# Altium project NB3000AL.PRJPCB (part 3 of 4)

## Sheet PULLDNx3.SCHDOC: Visual Indicators Top
size A4; DocumentNumber: 10; SheetNumber: 11; SheetTotal: 78
Used 10 times, as channels PULLDOWN, PULLDOWN, PULLDOWN, PULLDOWN, PULLDOWN, PULLDOWN, PULLDOWN, PULLDOWN, PULLDOWN, PULLDOWN. Parts and nets are listed once, with the designators drawn on the sheet.
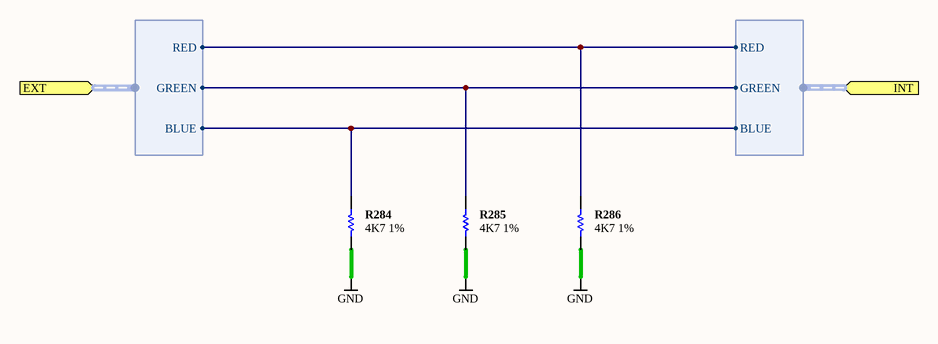
[diagram p14: PULLDNx3.SCHDOC]

### Parts
R284  4K7 1%  [RESC1005-STAR]
R285  4K7 1%  [RESC1005-STAR]
R286  4K7 1%  [RESC1005-STAR]

### Ports
EXT (harness RGB_LED), INT (harness RGB_LED)

### Harnesses
RGB_LED: GREEN, RED, BLUE

### Nets
GND: R284.1 R285.1 R286.1
NetR284_2: R284.2 ; port EXT.BLUE, port INT.BLUE
NetR285_2: R285.2 ; port EXT.GREEN, port INT.GREEN
NetR286_2: R286.2 ; port EXT.RED, port INT.RED

### Channels
PULLDOWN: designators R284=R311 R285=R312 R286=R313
PULLDOWN: designators R284=R308 R285=R309 R286=R310
PULLDOWN: designators R284=R305 R285=R306 R286=R307
PULLDOWN: designators R284=R302 R285=R303 R286=R304
PULLDOWN: designators R284=R299 R285=R300 R286=R301
PULLDOWN: designators R284=R296 R285=R297 R286=R298
PULLDOWN: designators R284=R293 R285=R294 R286=R295
PULLDOWN: designators R284=R290 R285=R291 R286=R292
PULLDOWN: designators R284=R287 R285=R288 R286=R289
PULLDOWN: no parts or ports

### Notes on the sheet
- Sheet Title
- Project Title
- Size:
- Date:
- A4
- Assy:
- Time:
- Revision:
- Sheet
- of
- File:

### Library data of the parts
R284-R286 = D-100-0088: as R1#3 on sheet FPGA; Category: Resistor; Mounting Technology: Surface Mount; Status: Production; Tolerance: 1 %

## Sheet LED_RGB_SMDx8.SCHDOC: Visual Indicators Top
size A4; DocumentNumber: 10; SheetNumber: 11; SheetTotal: 78
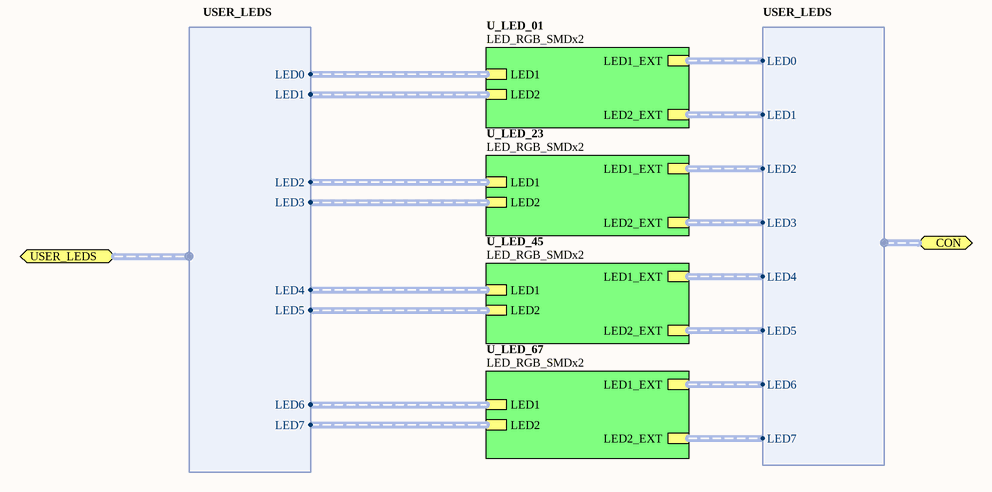
[diagram p15: LED_RGB_SMDx8.SCHDOC]

### Sub-sheets
U_LED_01 = LED_RGB_SMDx2 (file not in this document): LED1 (harness RGB_LED), LED2 (harness RGB_LED), LED1_EXT (harness RGB_LED), LED2_EXT (harness RGB_LED)
U_LED_23 = LED_RGB_SMDx2 (file not in this document): LED1 (harness RGB_LED), LED2 (harness RGB_LED), LED1_EXT (harness RGB_LED), LED2_EXT (harness RGB_LED)
U_LED_45 = LED_RGB_SMDx2 (file not in this document): LED1 (harness RGB_LED), LED2 (harness RGB_LED), LED1_EXT (harness RGB_LED), LED2_EXT (harness RGB_LED)
U_LED_67 = LED_RGB_SMDx2 (file not in this document): LED1 (harness RGB_LED), LED2 (harness RGB_LED), LED1_EXT (harness RGB_LED), LED2_EXT (harness RGB_LED)

### Ports
CON (harness USER_LEDS), USER_LEDS (harness USER_LEDS)

### Harnesses
USER_LEDS: LED0, LED1, LED2, LED3, LED4, LED5, LED6, LED7

### Notes on the sheet
- Sheet Title
- Project Title
- Size:
- Date:
- A4
- Assy:
- Time:
- Revision:
- Sheet
- of
- File:

## Sheet PWJACK+SWITCH.SchDoc: Power Jack & Switch
size A4; Organization: Altium Limited.; Address1: Level 3, 12a Rodborough Rd; Address2: Frenchs Forest 2086; Address3: NSW; Address4: AUSTRALIA; DocumentNumber: 20; Revision: 6; SheetNumber: 21; SheetTotal: 78
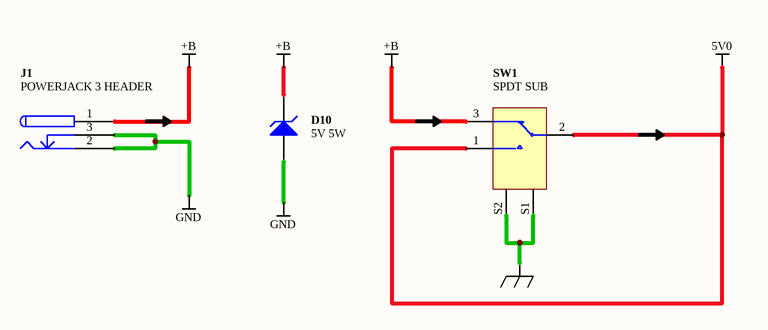
[diagram p16: PWJACK+SWITCH.SchDoc]

### Parts
(Parts that share a designator on the sheet are numbered #1, #2 ... from top to bottom, then left to right.)
D10  5V 5W  [DIOM8059]
J1#2  POWERJACK 3 HEADER  [KLD-0202]
SW1  SPDT SUB  [T8019L-TNQ]

### Nets
5V0: SW1.1 SW1.2
+B: D10.2(K) J1#2.1 SW1.3
GND: D10.1(A) J1#2.2 J1#2.3
SHIELD: SW1.S1 SW1.S2

### Notes on the sheet
- Sheet Title
- Project Title
- Size:
- Date:
- A4
- Assy:
- Time:
- Revision:
- Sheet
- of
- File:

### Library data of the parts
D10 = D-150-0001: Zener Diode, 5V 5W; Max Forward Current: mA; Rated Voltage: mV; Category: Diode-Zener; Mounting Technology: Surface Mount; Status: Production
J1#2 = D-300-0007: Connector, 3 Conductor Power Jack 2 break 2 aux contacts; ClassName: COMP_5V0; Category: Connector; Connector type: POWERJACK 3 HEADER; Status: Production
SW1 = D-301-0000: Switch, SPDT Subminiature Toggle; ClassName: COMP_5V0; Category: Switch; Status: Production

## Sheet Ethernet_RTL8201CL.SchDoc: Ethernet Interface
size A3; DocumentNumber: 21; SheetNumber: 22; SheetTotal: 78; Organization: Altium Limited.; Address1: Level 3, 12a Rodborough Rd; Address2: Frenchs Forest 2086; Address3: NSW; Address4: AUSTRALIA
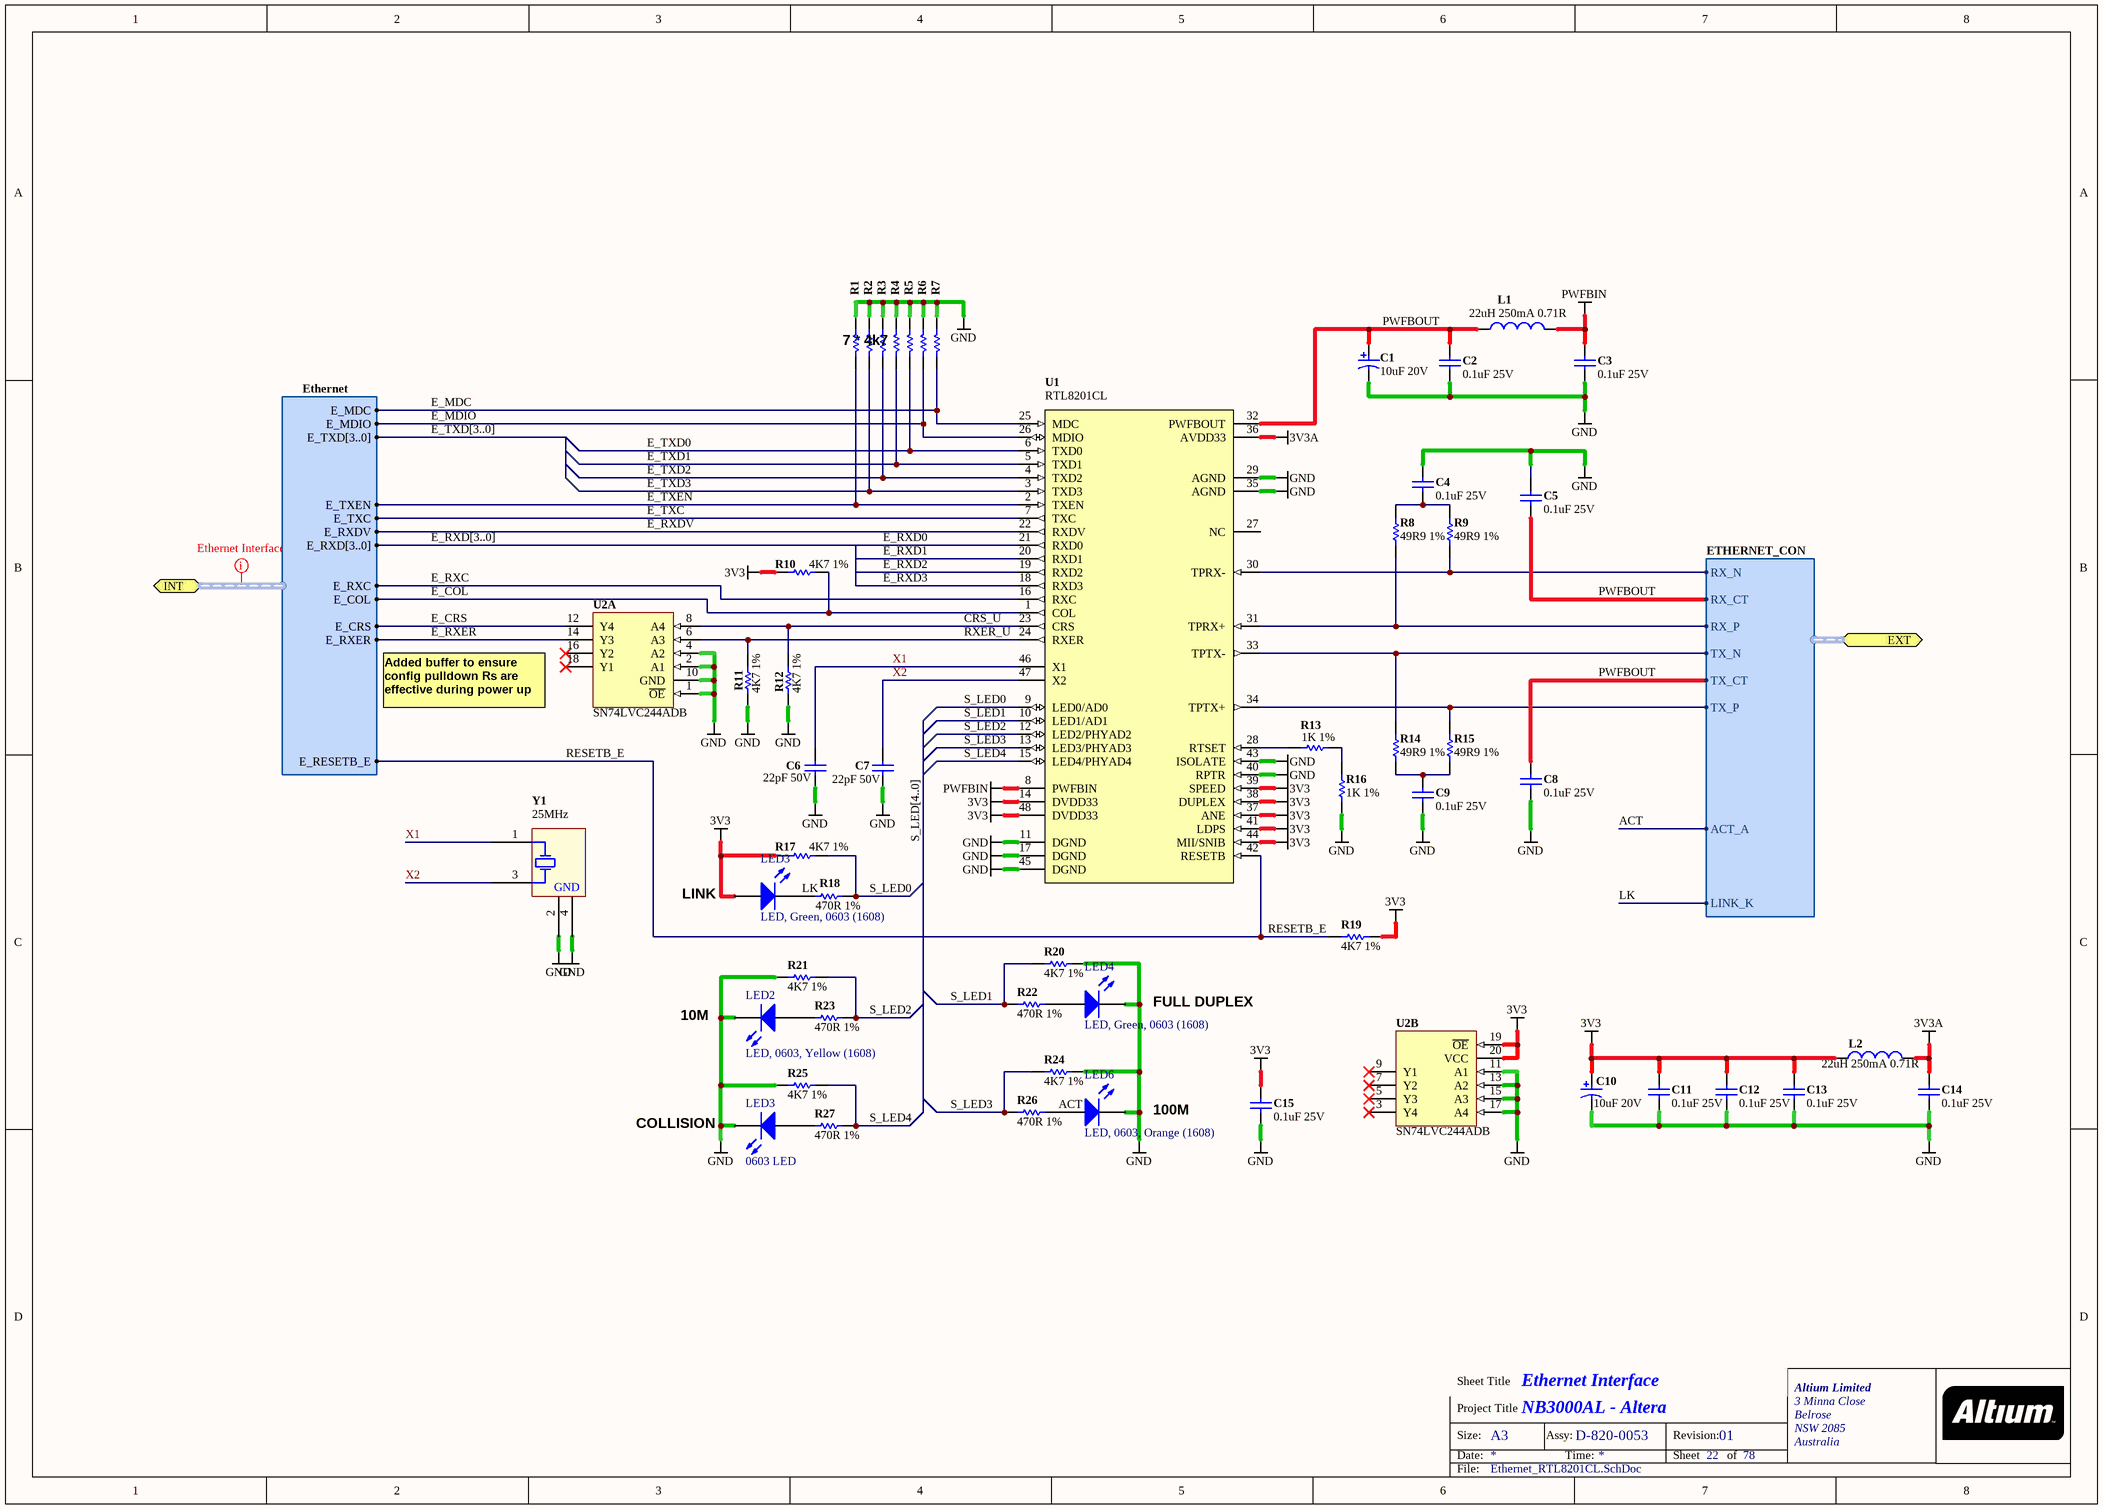
[diagram p17: Ethernet_RTL8201CL.SchDoc]

### Parts
(Parts that share a designator on the sheet are numbered #1, #2 ... from top to bottom, then left to right.)
C1#4  10uF 20V  [CAPC3528-STAR]
C2#4  0.1uF 25V  [CAPC1005-STAR]
C3#4  0.1uF 25V  [CAPC1005-STAR]
C4#4  0.1uF 25V  [CAPC1005-STAR]
C5#3  0.1uF 25V  [CAPC1005-STAR]
C6#2  22pF 50V  [CAPC1005-STAR]
C7#2  22pF 50V  [CAPC1005-STAR]
C8#2  0.1uF 25V  [CAPC1005-STAR]
C9#2  0.1uF 25V  [CAPC1005-STAR]
C10#2  10uF 20V  [CAPC3528-STAR]
C11#2  0.1uF 25V  [CAPC1005-STAR]
C12#2  0.1uF 25V  [CAPC1005-STAR]
C13#2  0.1uF 25V  [CAPC1005-STAR]
C14#2  0.1uF 25V  [CAPC1005-STAR]
C15#1  0.1uF 25V  [CAPC1005-STAR]
L1#2  22uH 250mA 0.71R  [INDC3225]
L2  22uH 250mA 0.71R  [INDC3225]
LED2  LED, 0603, Yellow (1608)  [0603LED_YELLOW]
LED3#1  LED, Green, 0603 (1608)  [0603LED_GREEN]
LED3#2  0603 LED  [0603LED_RED]
LED4  LED, Green, 0603 (1608)  [0603LED_GREEN]
LED6  LED, 0603, Orange (1608)  [0603LED_ORANGE]
R1#4  4K7 1%  [RESC1005-STAR]  (value not drawn)
R2#4  4K7 1%  [RESC1005-STAR]  (value not drawn)
R3#4  4K7 1%  [RESC1005-STAR]  (value not drawn)
R4#4  4K7 1%  [RESC1005-STAR]  (value not drawn)
R5#3  4K7 1%  [RESC1005-STAR]  (value not drawn)
R6#3  4K7 1%  [RESC1005-STAR]  (value not drawn)
R7#3  4K7 1%  [RESC1005-STAR]  (value not drawn)
R8#3  49R9 1%  [RESC2012-STAR]
R9#3  49R9 1%  [RESC2012-STAR]
R10#3  4K7 1%  [RESC1005-STAR]
R11#2  4K7 1%  [RESC1005-STAR]
R12#3  4K7 1%  [RESC1005-STAR]
R13#1  1K 1%  [RESC1005-STAR]
R14#2  49R9 1%  [RESC2012-STAR]
R15#1  49R9 1%  [RESC2012-STAR]
R16#1  1K 1%  [RESC1005-STAR]
R17  4K7 1%  [RESC1005-STAR]
R18#2  470R 1%  [RESC1005-STAR]
R19#1  4K7 1%  [RESC1005-STAR]
R20#2  4K7 1%  [RESC1005-STAR]
R21#1  4K7 1%  [RESC1005-STAR]
R22#2  470R 1%  [RESC1005-STAR]
R23#2  470R 1%  [RESC1005-STAR]
R24#2  4K7 1%  [RESC1005-STAR]
R25#1  4K7 1%  [RESC1005-STAR]
R26#1  470R 1%  [RESC1005-STAR]
R27#1  470R 1%  [RESC1005-STAR]
U1#4  RTL8201CL  [TSQFP50P900X900-48]
U2#1  SN74LVC244ADB  [SOP65P780-20]  (parts A,B of 2)
Y1#1  25MHz  [XTAL-200X126-4]

### Ports
EXT (harness ETHERNET_CON), INT (harness Ethernet)

### Harnesses
Ethernet: E_MDC, E_MDIO, E_TXD[3..0], E_TXC, E_TXEN, E_RXDV, E_RXD[3..0], E_RESETB_E, E_RXC, E_COL, E_CRS, E_RXER
ETHERNET_CON: TX_P, TX_N, RX_P, RX_N, RX_CT, TX_CT, LINK_K, ACT_A

### Nets
3V3: C10#2.1 C11#2.2 C12#2.2 C13#2.2 C15#1.2 L2.1 LED3#1.1(A) R10#3.2 R17.2 R19#1.2 U1#4.14(DVDD33) U1#4.37(ANE) U1#4.38(DUPLEX) U1#4.39(SPEED) U1#4.41(LDPS) U1#4.44(MII/SNIB) U1#4.48(DVDD33) U2#1.19(~{OE}) U2#1.20(VCC)
3V3A: C14#2.2 L2.2 U1#4.36(AVDD33)
GND: C1#4.2 C2#4.1 C3#4.1 C4#4.2 C5#3.2 C6#2.1 C7#2.1 C8#2.1 C9#2.1 C10#2.2 C11#2.1 C12#2.1 C13#2.1 C14#2.1 C15#1.1 LED2.2(K) LED3#2.2(K) LED4.2(K) LED6.2(K) R1#4.2 R2#4.2 R3#4.2 R4#4.2 R5#3.2 R6#3.2 R7#3.2 R11#2.2 R12#3.2 R16#1.1 R20#2.1 R21#1.2 R24#2.1 R25#1.2 U1#4.11(DGND) U1#4.17(DGND) U1#4.29(AGND) U1#4.35(AGND) U1#4.40(RPTR) U1#4.43(ISOLATE) U1#4.45(DGND) U2#1.1(~{OE}) U2#1.2(A1) U2#1.4(A2) U2#1.10(GND) U2#1.11(A1) U2#1.13(A2) U2#1.15(A3) U2#1.17(A4) Y1#1.2(GND) Y1#1.4(GND)
PWFBIN: C3#4.2 L1#2.2 U1#4.8(PWFBIN)
ACT: LED6.1(A) R26#1.2 ; port EXT.ACT_A
CRS_U: R12#3.1 U1#4.23(CRS) U2#1.8(A4)
E_COL: R10#3.1 U1#4.1(COL) ; port INT.E_COL
E_CRS: U2#1.12(Y4) ; port INT.E_CRS
E_MDC: R7#3.1 U1#4.25(MDC) ; port INT.E_MDC
E_MDIO: R6#3.1 U1#4.26(MDIO) ; port INT.E_MDIO
E_RXC: U1#4.16(RXC) ; port INT.E_RXC
E_RXD0: U1#4.21(RXD0)
E_RXD1: U1#4.20(RXD1)
E_RXD2: U1#4.19(RXD2)
E_RXD3: U1#4.18(RXD3)
E_RXDV: U1#4.22(RXDV) ; port INT.E_RXDV
E_RXER: U2#1.14(Y3) ; port INT.E_RXER
E_TXC: U1#4.7(TXC) ; port INT.E_TXC
E_TXD0: R5#3.1 U1#4.6(TXD0)
E_TXD1: R4#4.1 U1#4.5(TXD1)
E_TXD2: R3#4.1 U1#4.4(TXD2)
E_TXD3: R2#4.1 U1#4.3(TXD3)
E_TXEN: R1#4.1 U1#4.2(TXEN) ; port INT.E_TXEN
LK: LED3#1.2(K) R18#2.2 ; port EXT.LINK_K
PWFBOUT: C1#4.1 C2#4.2 C5#3.1 C8#2.2 L1#2.1 U1#4.32(PWFBOUT) ; port EXT.RX_CT, port EXT.TX_CT
RESETB_E: R19#1.1 U1#4.42(RESETB) ; port INT.E_RESETB_E
RXER_U: R11#2.1 U1#4.24(RXER) U2#1.6(A3)
S_LED0: R17.1 R18#2.1 U1#4.9(LED0/AD0)
S_LED1: R20#2.2 R22#2.1 U1#4.10(LED1/AD1)
S_LED2: R21#1.1 R23#2.1 U1#4.12(LED2/PHYAD2)
S_LED3: R24#2.2 R26#1.1 U1#4.13(LED3/PHYAD3)
S_LED4: R25#1.1 R27#1.1 U1#4.15(LED4/PHYAD4)
X1: C6#2.2 U1#4.46(X1) Y1#1.1(X1)
X2: C7#2.2 U1#4.47(X2) Y1#1.3(X2)
NetC4#4_1: C4#4.1 R8#3.2 R9#3.2
NetC9#2_2: C9#2.2 R14#2.1 R15#1.1
NetLED2_1: LED2.1(A) R23#2.2
NetLED3#2_1: LED3#2.1(A) R27#1.2
NetLED4_1: LED4.1(A) R22#2.2
NetR8#3_1: R8#3.1 U1#4.31(TPRX+) ; port EXT.RX_P
NetR9#3_1: R9#3.1 U1#4.30(TPRX-) ; port EXT.RX_N
NetR13#1_1: R13#1.1 R16#1.2
NetR13#1_2: R13#1.2 U1#4.28(RTSET)
NetR14#2_2: R14#2.2 U1#4.33(TPTX-) ; port EXT.TX_N
NetR15#1_2: R15#1.2 U1#4.34(TPTX+) ; port EXT.TX_P

Not connected (* = marked no-connect by the designer): U1#4 27(NC); U2#1 3(Y4)* 5(Y3)* 7(Y2)* 9(Y1)* 16(Y2)* 18(Y1)*

### Buses and harness runs
bus E_RXD[3..0]
bus E_TXD[3..0]
bus S_LED[4..0]

### Layout directives
net class Ethernet Interface: (no net found under the mark)

### Notes on the sheet
- (near R1#4) 7 * 4k7
- (near U2#1) Added buffer to ensure config pulldown Rs are effective during power up
- (near U2#1) LINK
- (near U2#1) 10M
- (near U2#1) FULL DUPLEX
- (near U2#1) COLLISION
- (near U2#1) 100M
- Sheet Title
- Project Title
- Size:
- Date:
- A3
- Assy:
- Time:
- Revision:
- Sheet
- of
- File:

### Library data of the parts
C1#4 C10#2 = D-101-0007: Capacitor, Tantalum, 10uF 10% 20V MCCT-B (3528); Polarity: Polarized; Capacitance: 10 uF; Category: Capacitor; Mounting Technology: Surface Mount; Rated Voltage: 20 V; Status: Production; Technology: Tantalum; Tolerance: 10 %
C2#4 C3#4 C4#4 C5#3 C8#2 C9#2 C11#2 C12#2 C13#2 C14#2 C15#1 = D-101-0045: Capacitor, Ceramic, 0.1uF 25V 0402 (1005); Dielectric: X7R; Polarity: Non-Polarized; Tolerance: 10 %; Capacitance: 0.1 uF; Category: Capacitor; Mounting Technology: Surface Mount; Rated Voltage: 25 V; Status: Deprecated; Technology: Ceramic
C6#2 C7#2 = D-101-0059: Capacitor, Ceramic, 22pF 5% 50V 0402 (1005) COG; Polarity: Non-Polarized; Capacitance: 22 pF; Category: Capacitor; Dielectric: COG; Mounting Technology: Surface Mount; Rated Voltage: 50 V; Status: Unreleased; Technology: Ceramic; Tolerance: 5 %
L1#2 L2 = D-102-0006: Inductor, Coil 22uH  1210 (3225) LQH32CN220K21L; Max Input Current: mA; Category: Inductor; Inductance: 22 uH; Mounting Technology: Surface Mount; Status: Production
LED2 = D-153-0007: Brightness: 120mcd; Color: Yellow/Amber; Peak Wave Length: nm; Category: LED; Mounting Technology: Surface Mount; Status: Production
LED3#1 LED4 = D-153-0002: Brightness: 50mcd; Peak Wave Length: nm; Category: LED; Color: Green; Mounting Technology: Surface Mount; Status: Production
LED3#2 = D-153-0009: LED, Red 0603 (1608) 63mCd; Peak Wave Length: 630nm; Category: LED; Brightness: 63mcd; Color: Red; Mounting Technology: Surface Mount; Status: Unreleased
LED6 = D-153-0006: Brightness: 200mcd; Peak Wave Length: nm; Category: LED; Color: Orange; Mounting Technology: Surface Mount; Status: Production
R1#4 R2#4 R3#4 R4#4 R5#3 R6#3 R7#3 R10#3 R11#2 R12#3 R17 R19#1 R20#2 R21#1 R24#2 R25#1 = D-100-0088: Resistor, 4K7 1% 0402 (1005); Power Rating: 63 mW; Resistance: 4.7 K; Category: Resistor; Mounting Technology: Surface Mount; Status: Production; Tolerance: 1 %
R8#3 R9#3 R14#2 R15#1 = D-100-0017: Resistor, 49R9 1% 0805 (2012); Power Rating: mW; Resistance: 49.9 R; Category: Resistor; Mounting Technology: Surface Mount; Status: Production; Tolerance: 1 %
R13#1 R16#1 = D-100-0121: Resistor, 1K 1% 0402 (1005); Power Rating: 63 mW; Category: Resistor; Mounting Technology: Surface Mount; Resistance: 1 K; Status: Production; Tolerance: 1 %
R18#2 R22#2 R23#2 R26#1 R27#1 = D-100-0093: Resistor, 470R 1% 0402 (1005); Power Rating: 63 mW; Category: Resistor; Mounting Technology: Surface Mount; Resistance: 470 R; Status: Production; Tolerance: 1 %
U1#4 = D-221-0000: RTL8201CL-VD, Single-Chip/Single-Port 10/100 Fast Ethernet Phyceiver; Comm Standard: None; Category: IC-Communication; Mounting Technology: Surface Mount; Status: Production
U2#1 = D-205-0000: SN74LVC244ADBR,  Octal Buffer/Driver with 3-State Outputs, 2.0V - 3.6V; Category: IC-Logic; Status: Production
Y1#1 = D-103-0030: Crystal, SMD, 25.000000MHz Stab=50ppm 18.0pF; Frequency Stability: 50ppm; Load Capacitance: 18pF; Nominal Operational Voltage: mV; Frequency Tolerance: 50ppm; Mounting Technology: Surface Mount; Nominal Fequency: 25MHz; Status: Unreleased; Category: Crystal

## Sheet HOST_JTAG.SchDoc: Local MCU Debug Connector
size A4; DocumentNumber: 24; SheetNumber: 25; SheetTotal: 78
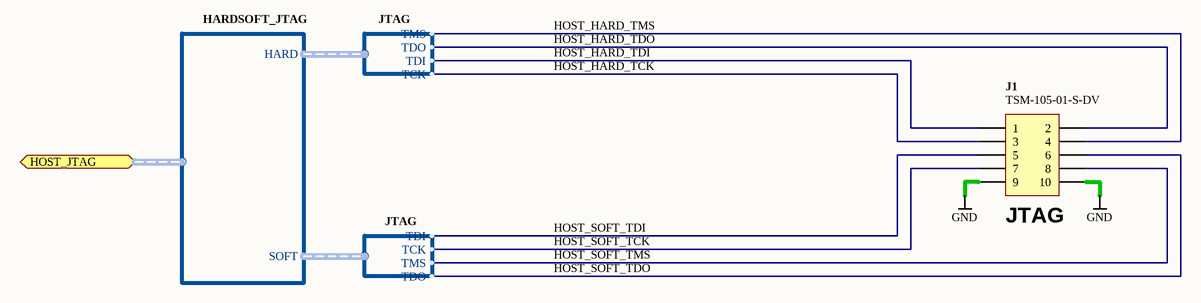
[diagram p18: HOST_JTAG.SchDoc]

### Parts
(Parts that share a designator on the sheet are numbered #1, #2 ... from top to bottom, then left to right.)
J1#3  TSM-105-01-S-DV  [TSM-105-01-DV]

### Ports
HOST_JTAG (harness HARDSOFT_JTAG)

### Harnesses
JTAG: TMS, TDO, TDI, TCK
HARDSOFT_JTAG: HARD, SOFT

### Nets
GND: J1#3.9 J1#3.10
HOST_HARD_TCK: J1#3.3 ; harness JTAG.TCK
HOST_HARD_TDI: J1#3.1 ; harness JTAG.TDI
HOST_HARD_TDO: J1#3.2 ; harness JTAG.TDO
HOST_HARD_TMS: J1#3.4 ; harness JTAG.TMS
HOST_SOFT_TCK: J1#3.7 ; harness JTAG.TCK
HOST_SOFT_TDI: J1#3.5 ; harness JTAG.TDI
HOST_SOFT_TDO: J1#3.6 ; harness JTAG.TDO
HOST_SOFT_TMS: J1#3.8 ; harness JTAG.TMS

### Notes on the sheet
- (near J1#3) JTAG
- Sheet Title
- Project Title
- Size:
- Date:
- A4
- Assy:
- Time:
- Revision:
- Sheet
- of
- File:

### Library data of the parts
J1#3 = D-300-0076: Non-Boxed Header IDC, 2 X 5 Pin SMD; Connector type: Boxed; Max Current: mA; Category: Connector; Mounting Technology: Surface Mount; Status: Unreleased

## Sheet USERPWR.SchDoc: USER IO Power Loopback
size A4; Organization: Altium Limited.
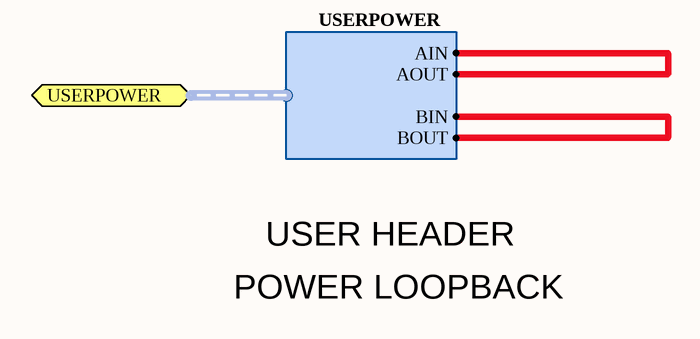
[diagram p19: USERPWR.SchDoc]

### Ports
USERPOWER (harness USERPOWER)

### Harnesses
USERPOWER: AIN, BIN, AOUT, BOUT

### Nets
(unnamed): port USERPOWER.AIN, port USERPOWER.AOUT
(unnamed): port USERPOWER.BIN, port USERPOWER.BOUT

### Notes on the sheet
- POWER LOOPBACK
- USER HEADER
- Sheet Title
- Project Title
- Size:
- Date:
- A4
- Assy:
- Time:
- Revision:
- Sheet
- of
- File:

## Sheet Host_FPGA.SchDoc: Host Controller - Altera - EP3C10
size A2; Organization: Altium Limited.; Revision: 6; PageSetup: Record=PageOptions|CenterHorizontal=True|CenterVertical=True|PrintScale=0.47|XCorrection=1.00|YCorrection=1.00|PrintKind=0|BorderSize=5000000|LeftOffset=0|BottomOffset=0|Orientation=2|PaperLength=1000|PaperWidth=1000|Scale=100|PaperSource=7|PrintQuality=1200|MediaType=1|DitherType=10|PaperKind=A4 (210 x 297 mm)|PrintScaleMode=1
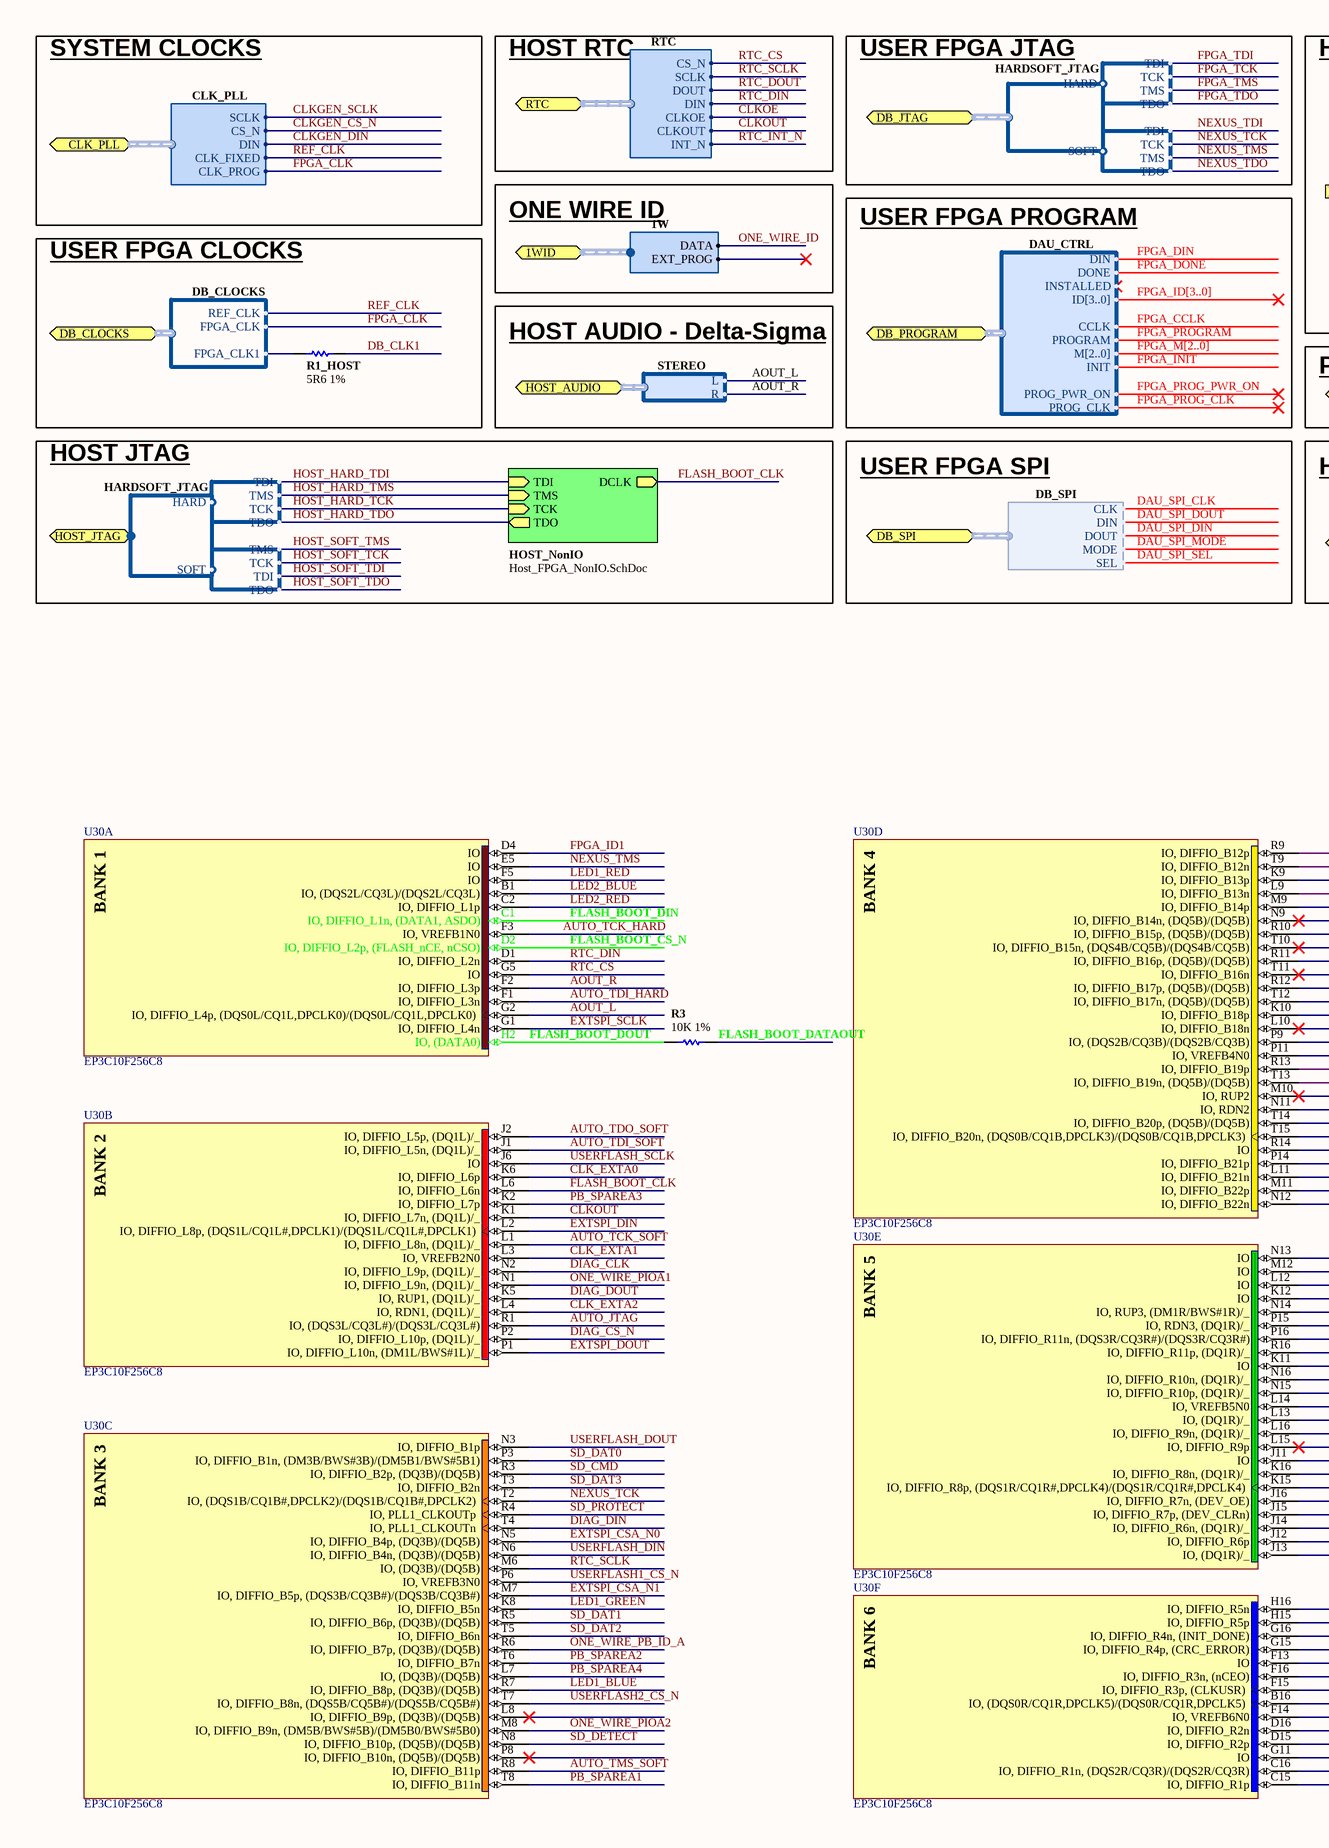
[diagram p20: Host_FPGA.SchDoc, left]
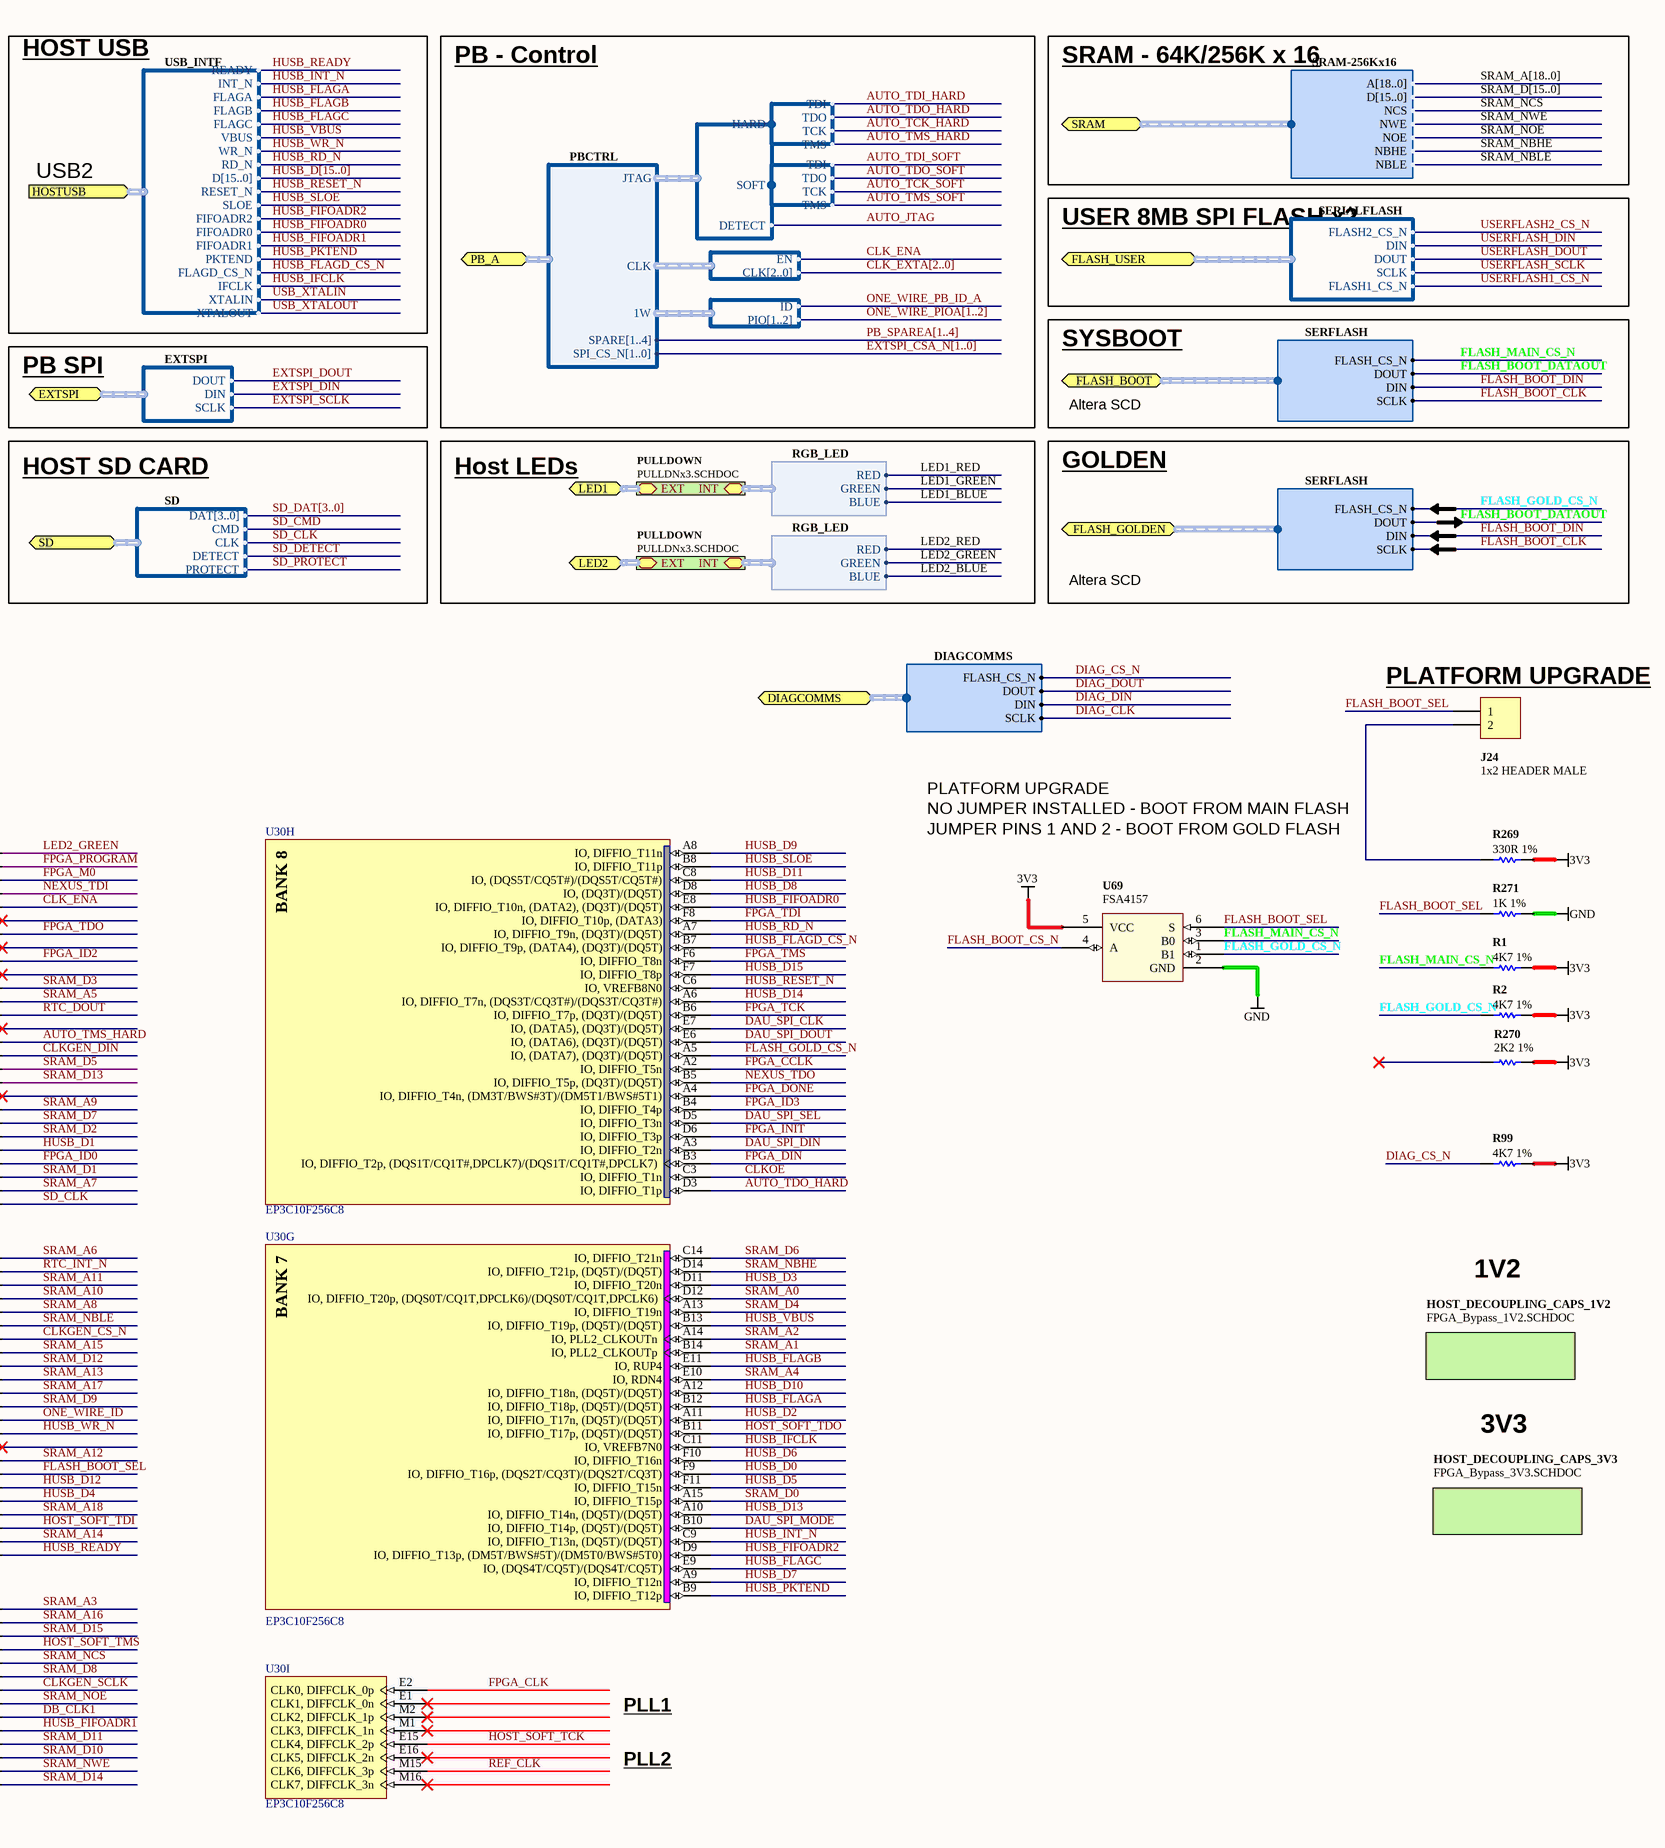
[diagram p21: Host_FPGA.SchDoc, right]

### Parts
(Parts that share a designator on the sheet are numbered #1, #2 ... from top to bottom, then left to right.)
J24  1x2 HEADER MALE  [HDR1X2]
R1#5  4K7 1%  [RESC1005-STAR]
R1_HOST  5R6 1%  [RESC1005-STAR]
R2#5  4K7 1%  [RESC1005-STAR]
R3#5  10K 1%  [RESC1005-STAR]
R99  4K7 1%  [RESC1005-STAR]
R269  330R 1%  [RESC1005-STAR]
R270  2K2 1%  [RESC1005-STAR]
R271  1K 1%  [RESC1005-STAR]
U30  EP3C10F256C8  [FBGA256-2]  (parts A,B,C,D,E,F,G,H,I of 13)
U69  FSA4157  [SC70_6L]

### Blocks framed on the sheet
USER FPGA CLOCKS: R1_HOST

### Sub-sheets
HOST_DECOUPLING_CAPS_1V2 = FPGA_Bypass_1V2.SCHDOC: no entries
HOST_DECOUPLING_CAPS_3V3 = FPGA_Bypass_3V3.SCHDOC: no entries
HOST_NonIO = Host_FPGA_NonIO.SchDoc: TMS (in), TCK (in), TDI (in), TDO (out), DCLK (out)
PULLDOWN = PULLDNx3.SCHDOC: EXT, INT (harness RGB_LED)
PULLDOWN = PULLDNx3.SCHDOC: EXT, INT (harness RGB_LED)

### Ports
1WID (harness 1W), CLK_PLL (harness CLK_PLL), DB_CLOCKS (harness DB_CLOCKS), DB_JTAG (harness HARDSOFT_JTAG), DB_PROGRAM (harness DAU_CTRL), DB_SPI (harness DB_SPI), DIAGCOMMS (harness DIAGCOMMS), EXTSPI (harness EXTSPI), FLASH_BOOT (harness SERFLASH), FLASH_GOLDEN (harness SERFLASH), FLASH_USER (harness SERIALFLASH), HOST_AUDIO (harness STEREO), HOST_JTAG (harness HARDSOFT_JTAG), HOSTUSB (harness USB_INTF), LED1 (harness RGB_LED), LED2 (harness RGB_LED), PB_A (harness PBCTRL), RTC (harness RTC), SD (harness SD), SRAM (harness SRAM-256Kx16)

### Harnesses
SERIALFLASH: FLASH2_CS_N, DIN, DOUT, SCLK, FLASH1_CS_N
JTAG: TMS, TDO, TDI, TCK
HARDSOFT_JTAG: HARD, SOFT
SD: DAT[3..0], CMD, CLK, DETECT, PROTECT
STEREO: L, R
RTC: CS_N, DIN, DOUT, INT_N, SCLK, CLKOUT, CLKOE
DAU_CTRL: DIN, DONE, INSTALLED, ID[3..0], CCLK, PROGRAM, M[2..0], INIT, PROG_PWR_ON, PROG_CLK
1W: DATA, EXT_PROG
CLK_PLL: CLK_FIXED, CLK_PROG, CS_N, DIN, SCLK
SRAM-256Kx16: A[18..0], D[15..0], NCS, NWE, NOE, NBHE, NBLE
RGB_LED: GREEN, RED, BLUE
DB_CLOCKS: REF_CLK, FPGA_CLK, FPGA_CLK1
DB_SPI: MODE, SEL, CLK, DIN, DOUT
JTAG_CONFIG: HARD, SOFT, DETECT
JTAG: TDI, TDO, TCK, TMS
GATE_CLOCKS: EN, CLK[2..0]
ONE_WIRE: ID, PIO[1..2]
PBCTRL: JTAG, CLK, 1W, SPI_CS_N[1..0], SPARE[1..4]
EXTSPI: DOUT, DIN, SCLK
SERFLASH: DIN, DOUT, SCLK, FLASH_CS_N
USB_INTF: READY, INT_N, SLOE, FIFOADR2, FIFOADR0, FIFOADR1, PKTEND, FLAGD_CS_N, FLAGA, FLAGB, FLAGC, WR_N, RD_N, D[15..0], RESET_N, IFCLK, XTALIN, VBUS, XTALOUT
DIAGCOMMS: DIN, DOUT, SCLK, FLASH_CS_N

### Nets
3V3: R1#5.2 R2#5.2 R99.2 R269.2 R270.2 U69.5(VCC)
GND: R271.2 U69.2(GND)
AOUT_L: U30.G2(IO,_DIFFIO_L4p,_(DQS0L/CQ1L,DPCLK0)/(DQS0L/CQ1L,DPCLK0)) ; port HOST_AUDIO.L
AOUT_R: U30.F2(IO,_DIFFIO_L3p) ; port HOST_AUDIO.R
AUTO_JTAG: U30.R1(IO,_(DQS3L/CQ3L#)/(DQS3L/CQ3L#)) ; harness JTAG_CONFIG.DETECT
AUTO_TCK_HARD: U30.F3(IO,_VREFB1N0) ; harness JTAG.TCK
AUTO_TCK_SOFT: U30.L1(IO,_DIFFIO_L8n,_(DQ1L)/_) ; harness JTAG.TCK
AUTO_TDI_HARD: U30.F1(IO,_DIFFIO_L3n) ; harness JTAG.TDI
AUTO_TDI_SOFT: U30.J1(IO,_DIFFIO_L5n,_(DQ1L)/_) ; harness JTAG.TDI
AUTO_TDO_HARD: U30.D3(IO,_DIFFIO_T1p) ; harness JTAG.TDO
AUTO_TDO_SOFT: U30.J2(IO,_DIFFIO_L5p,_(DQ1L)/_) ; harness JTAG.TDO
AUTO_TMS_HARD: U30.P9(IO,_(DQS2B/CQ3B)/(DQS2B/CQ3B)) ; harness JTAG.TMS
AUTO_TMS_SOFT: U30.R8(IO,_DIFFIO_B11p) ; harness JTAG.TMS
CLK_ENA: U30.M9(IO,_DIFFIO_B14p) ; harness GATE_CLOCKS.EN
CLK_EXTA0: U30.K6(IO,_DIFFIO_L6p)
CLK_EXTA1: U30.L3(IO,_VREFB2N0)
CLK_EXTA2: U30.L4(IO,_RDN1,_(DQ1L)/_)
CLKGEN_CS_N: U30.P16(IO,_DIFFIO_R11n,_(DQS3R/CQ3R#)/(DQS3R/CQ3R#)) ; port CLK_PLL.CS_N
CLKGEN_DIN: U30.P11(IO,_VREFB4N0) ; port CLK_PLL.DIN
CLKGEN_SCLK: U30.F15(IO,_DIFFIO_R3p,_(CLKUSR)) ; port CLK_PLL.SCLK
CLKOE: U30.C3(IO,_DIFFIO_T1n) ; port RTC.CLKOE
CLKOUT: U30.K1(IO,_DIFFIO_L7n,_(DQ1L)/_) ; port RTC.CLKOUT
DAU_SPI_CLK: U30.E7(IO,_(DATA5),_(DQ3T)/(DQ5T)) ; port DB_SPI.CLK
DAU_SPI_DIN: U30.A3(IO,_DIFFIO_T2n) ; port DB_SPI.DOUT
DAU_SPI_DOUT: U30.E6(IO,_(DATA6),_(DQ3T)/(DQ5T)) ; port DB_SPI.DIN
DAU_SPI_MODE: U30.B10(IO,_DIFFIO_T14p,_(DQ5T)/(DQ5T)) ; port DB_SPI.MODE
DAU_SPI_SEL: U30.D5(IO,_DIFFIO_T3n) ; port DB_SPI.SEL
DB_CLK1: R1_HOST.1 U30.F14(IO,_VREFB6N0)
DIAG_CLK: U30.N2(IO,_DIFFIO_L9p,_(DQ1L)/_) ; port DIAGCOMMS.SCLK
DIAG_CS_N: R99.1 U30.P2(IO,_DIFFIO_L10p,_(DQ1L)/_) ; port DIAGCOMMS.FLASH_CS_N
DIAG_DIN: U30.T4(IO,_PLL1_CLKOUTn) ; port DIAGCOMMS.DIN
DIAG_DOUT: U30.K5(IO,_RUP1,_(DQ1L)/_) ; port DIAGCOMMS.DOUT
EXTSPI_CSA_N0: U30.N5(IO,_DIFFIO_B4p,_(DQ3B)/(DQ5B))
EXTSPI_CSA_N1: U30.M7(IO,_DIFFIO_B5p,_(DQS3B/CQ3B#)/(DQS3B/CQ3B#))
EXTSPI_DIN: U30.L2(IO,_DIFFIO_L8p,_(DQS1L/CQ1L#,DPCLK1)/(DQS1L/CQ1L#,DPCLK1)) ; port EXTSPI.DIN
EXTSPI_DOUT: U30.P1(IO,_DIFFIO_L10n,_(DM1L/BWS#1L)/_) ; port EXTSPI.DOUT
EXTSPI_SCLK: U30.G1(IO,_DIFFIO_L4n) ; port EXTSPI.SCLK
FLASH_BOOT_CLK: U30.L6(IO,_DIFFIO_L6n) ; sheet HOST_NonIO/DCLK, port FLASH_BOOT.SCLK, port FLASH_GOLDEN.SCLK
FLASH_BOOT_CS_N: U30.D2(IO,_DIFFIO_L2p,_(FLASH_nCE,_nCSO)) U69.4(A)
FLASH_BOOT_DATAOUT: R3#5.2 ; port FLASH_BOOT.DOUT, port FLASH_GOLDEN.DOUT
FLASH_BOOT_DIN: U30.C1(IO,_DIFFIO_L1n,_(DATA1,_ASDO)) ; port FLASH_BOOT.DIN, port FLASH_GOLDEN.DIN
FLASH_BOOT_DOUT: R3#5.1 U30.H2(IO,_(DATA0))
FLASH_BOOT_SEL: J24.1 R271.1 U30.K16(IO,_DIFFIO_R8n,_(DQ1R)/_) U69.6(S)
FLASH_GOLD_CS_N: R2#5.1 U30.A5(IO,_(DATA7),_(DQ3T)/(DQ5T)) U69.1(B1) ; port FLASH_GOLDEN.FLASH_CS_N
FLASH_MAIN_CS_N: R1#5.1 U69.3(B0) ; port FLASH_BOOT.FLASH_CS_N
FPGA_CCLK: U30.A2(IO,_DIFFIO_T5n) ; port DB_PROGRAM.CCLK
FPGA_CLK: U30.E2(CLK0,_DIFFCLK_0p) ; port CLK_PLL.CLK_PROG, port DB_CLOCKS.FPGA_CLK
FPGA_DIN: U30.B3(IO,_DIFFIO_T2p,_(DQS1T/CQ1T#,DPCLK7)/(DQS1T/CQ1T#,DPCLK7)) ; port DB_PROGRAM.DIN
FPGA_DONE: U30.A4(IO,_DIFFIO_T4n,_(DM3T/BWS#3T)/(DM5T1/BWS#5T1)) ; port DB_PROGRAM.DONE
FPGA_ID0: U30.P14(IO,_DIFFIO_B21p)
FPGA_ID1: U30.D4(IO)
FPGA_ID2: U30.R11(IO,_DIFFIO_B16p,_(DQ5B)/(DQ5B))
FPGA_ID3: U30.B4(IO,_DIFFIO_T4p)
FPGA_INIT: U30.D6(IO,_DIFFIO_T3p) ; port DB_PROGRAM.INIT
FPGA_M0: U30.K9(IO,_DIFFIO_B13p)
FPGA_PROG_CLK: port DB_PROGRAM.PROG_CLK
FPGA_PROG_PWR_ON: port DB_PROGRAM.PROG_PWR_ON
FPGA_PROGRAM: U30.T9(IO,_DIFFIO_B12n) ; port DB_PROGRAM.PROGRAM
FPGA_TCK: U30.B6(IO,_DIFFIO_T7p,_(DQ3T)/(DQ5T)) ; harness JTAG.TCK
FPGA_TDI: U30.F8(IO,_DIFFIO_T10p,_(DATA3)) ; harness JTAG.TDI
FPGA_TDO: U30.R10(IO,_DIFFIO_B15p,_(DQ5B)/(DQ5B)) ; harness JTAG.TDO
FPGA_TMS: U30.F6(IO,_DIFFIO_T8n) ; harness JTAG.TMS
HOST_HARD_TCK: sheet HOST_NonIO/TCK, harness JTAG.TCK
HOST_HARD_TDI: sheet HOST_NonIO/TDI, harness JTAG.TDI
HOST_HARD_TDO: sheet HOST_NonIO/TDO, harness JTAG.TDO
HOST_HARD_TMS: sheet HOST_NonIO/TMS, harness JTAG.TMS
HOST_SOFT_TCK: U30.E15(CLK4,_DIFFCLK_2p) ; harness JTAG.TCK
HOST_SOFT_TDI: U30.J14(IO,_DIFFIO_R6n,_(DQ1R)/_) ; harness JTAG.TDI
HOST_SOFT_TDO: U30.B11(IO,_DIFFIO_T17p,_(DQ5T)/(DQ5T)) ; harness JTAG.TDO
HOST_SOFT_TMS: U30.G15(IO,_DIFFIO_R4p,_(CRC_ERROR)) ; harness JTAG.TMS
HUSB_D0: U30.F9(IO,_DIFFIO_T16p,_(DQS2T/CQ3T)/(DQS2T/CQ3T))
HUSB_D1: U30.R14(IO)
HUSB_D2: U30.A11(IO,_DIFFIO_T17n,_(DQ5T)/(DQ5T))
HUSB_D3: U30.D11(IO,_DIFFIO_T20n)
HUSB_D4: U30.J16(IO,_DIFFIO_R7n,_(DEV_OE))
HUSB_D5: U30.F11(IO,_DIFFIO_T15n)
HUSB_D6: U30.F10(IO,_DIFFIO_T16n)
HUSB_D7: U30.A9(IO,_DIFFIO_T12n)
HUSB_D8: U30.D8(IO,_(DQ3T)/(DQ5T))
HUSB_D9: U30.A8(IO,_DIFFIO_T11n)
HUSB_D10: U30.A12(IO,_DIFFIO_T18n,_(DQ5T)/(DQ5T))
HUSB_D11: U30.C8(IO,_(DQS5T/CQ5T#)/(DQS5T/CQ5T#))
HUSB_D12: U30.K15(IO,_DIFFIO_R8p,_(DQS1R/CQ1R#,DPCLK4)/(DQS1R/CQ1R#,DPCLK4))
HUSB_D13: U30.A10(IO,_DIFFIO_T14n,_(DQ5T)/(DQ5T))
HUSB_D14: U30.A6(IO,_DIFFIO_T7n,_(DQS3T/CQ3T#)/(DQS3T/CQ3T#))
HUSB_D15: U30.F7(IO,_DIFFIO_T8p)
HUSB_FIFOADR0: U30.E8(IO,_DIFFIO_T10n,_(DATA2),_(DQ3T)/(DQ5T)) ; port HOSTUSB.FIFOADR0
HUSB_FIFOADR1: U30.D16(IO,_DIFFIO_R2n) ; port HOSTUSB.FIFOADR1
HUSB_FIFOADR2: U30.D9(IO,_DIFFIO_T13p,_(DM5T/BWS#5T)/(DM5T0/BWS#5T0)) ; port HOSTUSB.FIFOADR2
HUSB_FLAGA: U30.B12(IO,_DIFFIO_T18p,_(DQ5T)/(DQ5T)) ; port HOSTUSB.FLAGA
HUSB_FLAGB: U30.E11(IO,_RUP4) ; port HOSTUSB.FLAGB
HUSB_FLAGC: U30.E9(IO,_(DQS4T/CQ5T)/(DQS4T/CQ5T)) ; port HOSTUSB.FLAGC
HUSB_FLAGD_CS_N: U30.B7(IO,_DIFFIO_T9p,_(DATA4),_(DQ3T)/(DQ5T)) ; port HOSTUSB.FLAGD_CS_N
HUSB_IFCLK: U30.C11(IO,_VREFB7N0) ; port HOSTUSB.IFCLK
HUSB_INT_N: U30.C9(IO,_DIFFIO_T13n,_(DQ5T)/(DQ5T)) ; port HOSTUSB.INT_N
HUSB_PKTEND: U30.B9(IO,_DIFFIO_T12p) ; port HOSTUSB.PKTEND
HUSB_RD_N: U30.A7(IO,_DIFFIO_T9n,_(DQ3T)/(DQ5T)) ; port HOSTUSB.RD_N
HUSB_READY: U30.J13(IO,_(DQ1R)/_) ; port HOSTUSB.READY
HUSB_RESET_N: U30.C6(IO,_VREFB8N0) ; port HOSTUSB.RESET_N
HUSB_SLOE: U30.B8(IO,_DIFFIO_T11p) ; port HOSTUSB.SLOE
HUSB_VBUS: U30.B13(IO,_DIFFIO_T19p,_(DQ5T)/(DQ5T)) ; port HOSTUSB.VBUS
HUSB_WR_N: U30.L16(IO,_DIFFIO_R9n,_(DQ1R)/_) ; port HOSTUSB.WR_N
LED1_BLUE: U30.R7(IO,_DIFFIO_B8p,_(DQ3B)/(DQ5B)) ; sheet PULLDOWN/INT.BLUE
LED1_GREEN: U30.K8(IO,_DIFFIO_B5n) ; sheet PULLDOWN/INT.GREEN
LED1_RED: U30.F5(IO) ; sheet PULLDOWN/INT.RED
LED2_BLUE: U30.B1(IO,_(DQS2L/CQ3L)/(DQS2L/CQ3L)) ; sheet PULLDOWN/INT.BLUE
LED2_GREEN: U30.R9(IO,_DIFFIO_B12p) ; sheet PULLDOWN/INT.GREEN
LED2_RED: U30.C2(IO,_DIFFIO_L1p) ; sheet PULLDOWN/INT.RED
NEXUS_TCK: U30.T2(IO,_(DQS1B/CQ1B#,DPCLK2)/(DQS1B/CQ1B#,DPCLK2)) ; harness JTAG.TCK
NEXUS_TDI: U30.L9(IO,_DIFFIO_B13n) ; harness JTAG.TDI
NEXUS_TDO: U30.B5(IO,_DIFFIO_T5p,_(DQ3T)/(DQ5T)) ; harness JTAG.TDO
NEXUS_TMS: U30.E5(IO) ; harness JTAG.TMS
ONE_WIRE_ID: U30.L13(IO,_(DQ1R)/_) ; port 1WID.DATA
ONE_WIRE_PB_ID_A: U30.R6(IO,_DIFFIO_B7p,_(DQ3B)/(DQ5B)) ; harness ONE_WIRE.ID
ONE_WIRE_PIOA1: U30.N1(IO,_DIFFIO_L9n,_(DQ1L)/_)
ONE_WIRE_PIOA2: U30.M8(IO,_DIFFIO_B9n,_(DM5B/BWS#5B)/(DM5B0/BWS#5B0))
PB_SPAREA1: U30.T8(IO,_DIFFIO_B11n)
PB_SPAREA2: U30.T6(IO,_DIFFIO_B7n)
PB_SPAREA3: U30.K2(IO,_DIFFIO_L7p)
PB_SPAREA4: U30.L7(IO,_(DQ3B)/(DQ5B))
REF_CLK: U30.M15(CLK6,_DIFFCLK_3p) ; port CLK_PLL.CLK_FIXED, port DB_CLOCKS.REF_CLK
RTC_CS: U30.G5(IO) ; port RTC.CS_N
RTC_DIN: U30.D1(IO,_DIFFIO_L2n) ; port RTC.DIN
RTC_DOUT: U30.K10(IO,_DIFFIO_B18p) ; port RTC.DOUT
RTC_INT_N: U30.M12(IO) ; port RTC.INT_N
RTC_SCLK: U30.M6(IO,_(DQ3B)/(DQ5B)) ; port RTC.SCLK
SD_CLK: U30.N12(IO,_DIFFIO_B22n) ; port SD.CLK
SD_CMD: U30.R3(IO,_DIFFIO_B2p,_(DQ3B)/(DQ5B)) ; port SD.CMD
SD_DAT0: U30.P3(IO,_DIFFIO_B1n,_(DM3B/BWS#3B)/(DM5B1/BWS#5B1))
SD_DAT1: U30.R5(IO,_DIFFIO_B6p,_(DQ3B)/(DQ5B))
SD_DAT2: U30.T5(IO,_DIFFIO_B6n)
SD_DAT3: U30.T3(IO,_DIFFIO_B2n)
SD_DETECT: U30.N8(IO,_DIFFIO_B10p,_(DQ5B)/(DQ5B)) ; port SD.DETECT
SD_PROTECT: U30.R4(IO,_PLL1_CLKOUTp) ; port SD.PROTECT
SRAM_A0: U30.D12(IO,_DIFFIO_T20p,_(DQS0T/CQ1T,DPCLK6)/(DQS0T/CQ1T,DPCLK6))
SRAM_A1: U30.B14(IO,_PLL2_CLKOUTp)
SRAM_A2: U30.A14(IO,_PLL2_CLKOUTn)
SRAM_A3: U30.H16(IO,_DIFFIO_R5n)
SRAM_A4: U30.E10(IO,_RDN4)
SRAM_A5: U30.T12(IO,_DIFFIO_B17n,_(DQ5B)/(DQ5B))
SRAM_A6: U30.N13(IO)
SRAM_A7: U30.M11(IO,_DIFFIO_B22p)
SRAM_A8: U30.N14(IO,_RUP3,_(DM1R/BWS#1R)/_)
SRAM_A9: U30.N11(IO,_RDN2)
SRAM_A10: U30.K12(IO)
SRAM_A11: U30.L12(IO)
SRAM_A12: U30.J11(IO)
SRAM_A13: U30.N16(IO,_DIFFIO_R10n,_(DQ1R)/_)
SRAM_A14: U30.J12(IO,_DIFFIO_R6p)
SRAM_A15: U30.R16(IO,_DIFFIO_R11p,_(DQ1R)/_)
SRAM_A16: U30.H15(IO,_DIFFIO_R5p)
SRAM_A17: U30.N15(IO,_DIFFIO_R10p,_(DQ1R)/_)
SRAM_A18: U30.J15(IO,_DIFFIO_R7p,_(DEV_CLRn))
SRAM_D0: U30.A15(IO,_DIFFIO_T15p)
SRAM_D1: U30.L11(IO,_DIFFIO_B21n)
SRAM_D2: U30.T15(IO,_DIFFIO_B20n,_(DQS0B/CQ1B,DPCLK3)/(DQS0B/CQ1B,DPCLK3))
SRAM_D3: U30.R12(IO,_DIFFIO_B17p,_(DQ5B)/(DQ5B))
SRAM_D4: U30.A13(IO,_DIFFIO_T19n)
SRAM_D5: U30.R13(IO,_DIFFIO_B19p)
SRAM_D6: U30.C14(IO,_DIFFIO_T21n)
SRAM_D7: U30.T14(IO,_DIFFIO_B20p,_(DQ5B)/(DQ5B))
SRAM_D8: U30.F16(IO,_DIFFIO_R3n,_(nCEO))
SRAM_D9: U30.L14(IO,_VREFB5N0)
SRAM_D10: U30.G11(IO)
SRAM_D11: U30.D15(IO,_DIFFIO_R2p)
SRAM_D12: U30.K11(IO)
SRAM_D13: U30.T13(IO,_DIFFIO_B19n,_(DQ5B)/(DQ5B))
SRAM_D14: U30.C15(IO,_DIFFIO_R1p)
SRAM_D15: U30.G16(IO,_DIFFIO_R4n,_(INIT_DONE))
SRAM_NBHE: U30.D14(IO,_DIFFIO_T21p,_(DQ5T)/(DQ5T)) ; port SRAM.NBHE
SRAM_NBLE: U30.P15(IO,_RDN3,_(DQ1R)/_) ; port SRAM.NBLE
SRAM_NCS: U30.F13(IO) ; port SRAM.NCS
SRAM_NOE: U30.B16(IO,_(DQS0R/CQ1R,DPCLK5)/(DQS0R/CQ1R,DPCLK5)) ; port SRAM.NOE
SRAM_NWE: U30.C16(IO,_DIFFIO_R1n,_(DQS2R/CQ3R)/(DQS2R/CQ3R)) ; port SRAM.NWE
USB_XTALIN: port HOSTUSB.XTALIN
USB_XTALOUT: port HOSTUSB.XTALOUT
USERFLASH1_CS_N: U30.P6(IO,_VREFB3N0) ; port FLASH_USER.FLASH1_CS_N
USERFLASH2_CS_N: U30.T7(IO,_DIFFIO_B8n,_(DQS5B/CQ5B#)/(DQS5B/CQ5B#)) ; port FLASH_USER.FLASH2_CS_N
USERFLASH_DIN: U30.N6(IO,_DIFFIO_B4n,_(DQ3B)/(DQ5B)) ; port FLASH_USER.DIN
USERFLASH_DOUT: U30.N3(IO,_DIFFIO_B1p) ; port FLASH_USER.DOUT
USERFLASH_SCLK: U30.J6(IO) ; port FLASH_USER.SCLK
NetJ24_2: J24.2 R269.1
NetR1_HOST_2: R1_HOST.2 ; port DB_CLOCKS.FPGA_CLK1

Not connected (* = marked no-connect by the designer): R270 1*; U30 E1(CLK1,_DIFFCLK_0n)* E16(CLK5,_DIFFCLK_2n)* L8(IO,_DIFFIO_B9p,_(DQ3B)/(DQ5B))* L10(IO,_DIFFIO_B18n)* L15(IO,_DIFFIO_R9p)* M1(CLK3,_DIFFCLK_1n)* M2(CLK2,_DIFFCLK_1p)* M10(IO,_RUP2)* M16(CLK7,_DIFFCLK_3n)* N9(IO,_DIFFIO_B14n,_(DQ5B)/(DQ5B))* P8(IO,_DIFFIO_B10n,_(DQ5B)/(DQ5B))* T10(IO,_DIFFIO_B15n,_(DQS4B/CQ5B)/(DQS4B/CQ5B))* T11(IO,_DIFFIO_B16n)*

### Buses and harness runs
bus CLK_EXTA[2..0]
bus EXTSPI_CSA_N[1..0]
bus FPGA_ID[3..0]
bus FPGA_M[2..0]
bus HUSB_D[15..0]
bus ONE_WIRE_PIOA[1..2]
bus PB_SPAREA[1..4]
bus SD_DAT[3..0]
bus SRAM_A[18..0]
bus SRAM_D[15..0]
harness port LED1 = sheet PULLDOWN/EXT
harness port LED2 = sheet PULLDOWN/EXT

### Notes on the sheet
- SYSTEM CLOCKS
- HOST RTC
- USER FPGA JTAG
- HOST USB
- PB - Control
- SRAM - 64K/256K x 16
- USB2
- ONE WIRE ID
- USER FPGA PROGRAM
- USER 8MB SPI FLASH x2
- HOST AUDIO - Delta-Sigma
- PB SPI
- SYSBOOT
- HOST JTAG
- Altera SCD
- USER FPGA SPI
- HOST SD CARD
- Host LEDs
- GOLDEN
- (near J24) PLATFORM UPGRADE
- PLATFORM UPGRADE
- NO JUMPER INSTALLED - BOOT FROM MAIN FLASH
- JUMPER PINS 1 AND 2 - BOOT FROM GOLD FLASH
- 1V2
- 3V3
- PLL1
- PLL2
- Project Title
- Sheet Title
- Size:
- Date:
- File:
- A2
- Assy:
- Time:
- Revision:
- Sheet
- of
- (in symbol D-241-0001, part A) BANK 0
- (in symbol D-241-0001, part B) BANK 1
- (in symbol D-241-0001, part C) BANK 2
- (in symbol D-241-0001, part D) BANK 3
- (in symbol D-241-0001, part E) BANK 4
- (in symbol D-241-0001, part F) BANK 5
- (in symbol D-241-0001, part G) BANK 6
- (in symbol D-241-0001, part H) BANK 7

### Library data of the parts
J24 = D-300-0020: Header IDC, 2 x 1 Pin Vertical 2.54mm Pitch (Non-Boxed, Male); Max Current: 3 A; Category: Connector; Connector type: Header; Mounting Technology: Through-Hole; Pin Count: 2; Status: Production
R1#5 R2#5 R99 = D-100-0088: as R1#4 on sheet Ethernet_RTL8201CL; Category: Resistor; Mounting Technology: Surface Mount; Status: Production; Tolerance: 1 %
R1_HOST = D-100-0085: Resistor, 5R6 1% 0402 (1005); Power Rating: 63 mW; Resistance: 5.6 R; Category: Resistor; Status: Production; Mounting Technology: Surface Mount; Tolerance: 1 %
R3#5 = D-100-0130: Resistor, 10K 1% 0402 (1005); Power Rating: 63 mW; Category: Resistor; Mounting Technology: Surface Mount; Resistance: 10 K; Status: Production; Tolerance: 1 %
R269 = D-100-0121: UPDATE FROM UL LIBRARIES; Power Rating: 63 mW; Resistance: 1 K; Category: Resistor; Mounting Technology: Surface Mount; Status: Production; Tolerance: 1 %
R270 = D-100-0107: Resistor, 2K2 1% 0402 (1005); Power Rating: 63 mW; Resistance: 2.2 K; Category: Resistor; Mounting Technology: Surface Mount; Status: Production; Tolerance: 1 %
R271 = D-100-0130: UPDATE FROM UL LIBRARIES; Power Rating: 63 mW; Resistance: 10 K; Category: Resistor; Mounting Technology: Surface Mount; Status: Production; Tolerance: 1 %
U30 = EP3C10F256C8: Cyclone III Family FPGA, 182 I/O Pins, 4 PLLs, 256-Pin FBGA, Speed Grade 8, Commercial Grade; Published: 26-Feb-2007; DatasheetVersion: ver2.0, May-2008; PackageVersion: ver15.1, May-2008; PackageReference: FBGA256-2; Publisher: Altium Limited; PackageDescription: 256-Ball FineLine Ball Grid Array (FBGA256) - Option 2 - Wire Bond; Code_JEDEC: MO-192-DAF-1; ComponentLink1Description: Manufacturer Link; ComponentLink1URL: http://www.altera.com/; ComponentLink2Description: Handbook (7.86MB); ComponentLink2URL: http://www.altera.com/literature/hb/cyc3/cyclone3_handbook.pdf; ComponentLink3Description: Packaging Specification; ComponentLink3URL: http://www.altera.com/literature/ds/dspkg.pdf
U69 = D-200-0006: Low Voltage 1R  SPDT Analog Switc; Supply Voltage: mV; Mounting Technology: Surface Mount; Status: Unreleased; Category: IC-Analog

## Sheet HOST_FPGA_NonIO.SchDoc: Host FPGA Pwr and Programming
size A4; Organization: Altium Limited.
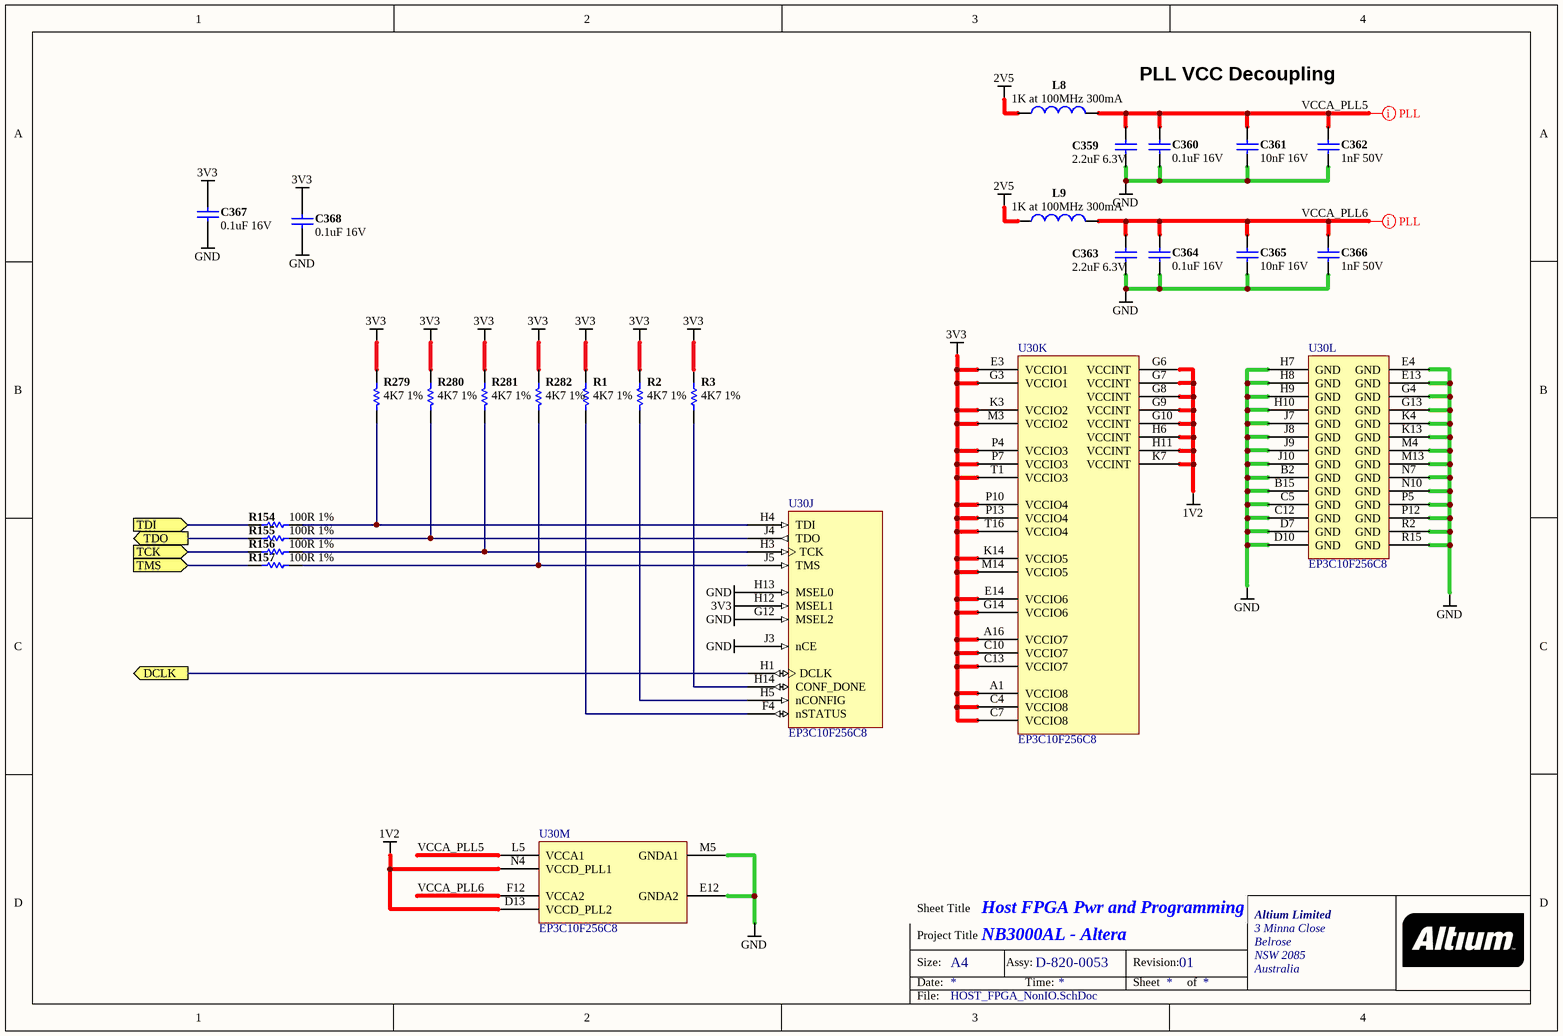
[diagram p22: HOST_FPGA_NonIO.SchDoc]

### Parts
(Parts that share a designator on the sheet are numbered #1, #2 ... from top to bottom, then left to right.)
C359  2.2uF 6.3V  [CAPC1005-STAR]
C360  0.1uF 16V  [CAPC1005-STAR]
C361  10nF 16V  [CAPC1005-STAR]
C362  1nF 50V  [CAPC1005-STAR]
C363  2.2uF 6.3V  [CAPC1005-STAR]
C364  0.1uF 16V  [CAPC1005-STAR]
C365  10nF 16V  [CAPC1005-STAR]
C366  1nF 50V  [CAPC1005-STAR]
C367  0.1uF 16V  [CAPC1005-STAR]
C368  0.1uF 16V  [CAPC1005-STAR]
L8  1K at 100MHz 300mA  [INDC1005]
L9  1K at 100MHz 300mA  [INDC1005]
R1#6  4K7 1%  [RESC1005-STAR]
R2#6  4K7 1%  [RESC1005-STAR]
R3#6  4K7 1%  [RESC1005-STAR]
R154#2  100R 1%  [RESC1005-STAR]
R155  100R 1%  [RESC1005-STAR]
R156  100R 1%  [RESC1005-STAR]
R157  100R 1%  [RESC1005-STAR]
R279  4K7 1%  [RESC1005-STAR]
R280  4K7 1%  [RESC1005-STAR]
R281  4K7 1%  [RESC1005-STAR]
R282  4K7 1%  [RESC1005-STAR]
U30  EP3C10F256C8  [FBGA256-2]  (parts J,K,L,M of 13)

### Ports
DCLK (out), TCK (in), TDI (in), TDO (out), TMS (in)

### Nets
1V2: U30.D13(VCCD_PLL2) U30.G6(VCCINT) U30.G7(VCCINT) U30.G8(VCCINT) U30.G9(VCCINT) U30.G10(VCCINT) U30.H6(VCCINT) U30.H11(VCCINT) U30.K7(VCCINT) U30.N4(VCCD_PLL1)
2V5: L8.1 L9.1
3V3: C367.1 C368.1 R1#6.1 R2#6.1 R3#6.1 R279.1 R280.1 R281.1 R282.1 U30.A1(VCCIO8) U30.A16(VCCIO7) U30.C4(VCCIO8) U30.C7(VCCIO8) U30.C10(VCCIO7) U30.C13(VCCIO7) U30.E3(VCCIO1) U30.E14(VCCIO6) U30.G3(VCCIO1) U30.G14(VCCIO6) U30.H12(MSEL1) U30.K3(VCCIO2) U30.K14(VCCIO5) U30.M3(VCCIO2) U30.M14(VCCIO5) U30.P4(VCCIO3) U30.P7(VCCIO3) U30.P10(VCCIO4) U30.P13(VCCIO4) U30.T1(VCCIO3) U30.T16(VCCIO4)
GND: C359.2 C360.2 C361.2 C362.2 C363.2 C364.2 C365.2 C366.2 C367.2 C368.2 U30.B2(GND) U30.B15(GND) U30.C5(GND) U30.C12(GND) U30.D7(GND) U30.D10(GND) U30.E4(GND) U30.E12(GNDA2) U30.E13(GND) U30.G4(GND) U30.G12(MSEL2) U30.G13(GND) U30.H7(GND) U30.H8(GND) U30.H9(GND) U30.H10(GND) U30.H13(MSEL0) U30.J3(nCE) U30.J7(GND) U30.J8(GND) U30.J9(GND) U30.J10(GND) U30.K4(GND) U30.K13(GND) U30.M4(GND) U30.M5(GNDA1) U30.M13(GND) U30.N7(GND) U30.N10(GND) U30.P5(GND) U30.P12(GND) U30.R2(GND) U30.R15(GND)
FLASH_BOOT_CLK: U30.H1(DCLK) ; port DCLK
HOST_HARD_TCK: R156.1 ; port TCK
HOST_HARD_TDI: R154#2.1 ; port TDI
HOST_HARD_TDO: R155.1 ; port TDO
HOST_HARD_TMS: R157.1 ; port TMS
VCCA_PLL5: C359.1 C360.1 C361.1 C362.1 L8.2 U30.L5(VCCA1)
VCCA_PLL6: C363.1 C364.1 C365.1 C366.1 L9.2 U30.F12(VCCA2)
NetR1#6_2: R1#6.2 U30.F4(nSTATUS)
NetR2#6_2: R2#6.2 U30.H5(nCONFIG)
NetR3#6_2: R3#6.2 U30.H14(CONF_DONE)
NetR154#2_2: R154#2.2 R279.2 U30.H4(TDI)
NetR155_2: R155.2 R280.2 U30.J4(TDO)
NetR156_2: R156.2 R281.2 U30.H3(TCK)
NetR157_2: R157.2 R282.2 U30.J5(TMS)

### Layout directives
net class PLL: VCCA_PLL5, VCCA_PLL6

### Notes on the sheet
- PLL VCC Decoupling
- Sheet Title
- Project Title
- Size:
- Date:
- A4
- Assy:
- Time:
- Revision:
- Sheet
- of
- File:

### Library data of the parts
C359 C363 = D-101-0112: Capacitor, Ceramic, 2.2uF 10% 6.3V 0402 (1005) X5R; Polarity: Non-Polarized; Tolerance: 20 %; Capacitance: 2.2 uF; Dielectric: X5R; Mounting Technology: Surface Mount; Rated Voltage: 6.3 V; Status: Unreleased; Technology: None; Category: Capacitor
C360 C364 C367 C368 = D-101-0080: Capacitor, Ceramic, 0.1uF 10% 16V 0402 (1005) X7R; Polarity: Non-Polarized; Capacitance: 0.1 uF; Dielectric: X7R; Mounting Technology: Surface Mount; Rated Voltage: 16 V; Status: Production; Technology: Ceramic; Tolerance: 10 %; Category: Capacitor
C361 C365 = D-101-0077: Capacitor, Ceramic, 10nF 10% 16V 0402 (1005) X7R; Polarity: Non-Polarized; Capacitance: 10 nF; Dielectric: X7R; Mounting Technology: Surface Mount; Rated Voltage: 16 V; Status: Production; Technology: Ceramic; Tolerance: 10 %; Category: Capacitor
C362 C366 = D-101-0030: Capacitor, Ceramic, 1nF 10% 50V 0402 (1005) X7R; Polarity: Non-Polarized; Capacitance: 1 nF; Dielectric: X7R; Mounting Technology: Surface Mount; Rated Voltage: 50 V; Status: Production; Technology: Ceramic; Tolerance: 10 %; Category: Capacitor
L8 L9 = D-102-0026: Inductor, Ferrite Bead 1K@100MHz 300mA 0402 BK1005HS102-T; Inductance: nH; Max Input Current: 300 mA; Mounting Technology: Surface Mount; Status: Production; Category: Inductor
R1#6 R2#6 R3#6 R279-R282 = D-100-0088: as R1#4 on sheet Ethernet_RTL8201CL; Category: Resistor; Mounting Technology: Surface Mount; Status: Production; Tolerance: 1 %
R154#2 R155-R157 = D-100-0131: Resistor, 100R 1% 0402 (1005); Power Rating: 63 mW; Mounting Technology: Surface Mount; Resistance: 100 R; Status: Production; Tolerance: 1 %; Category: Resistor
U30 = EP3C10F256C8: as U30 on sheet Host_FPGA; Published: 26-Feb-2007; DatasheetVersion: ver2.0, May-2008; PackageVersion: ver15.1, May-2008; PackageReference: FBGA256-2; Publisher: Altium Limited; PackageDescription: 256-Ball FineLine Ball Grid Array (FBGA256) - Option 2 - Wire Bond; Code_JEDEC: MO-192-DAF-1; ComponentLink1Description: Manufacturer Link; ComponentLink1URL: http://www.altera.com/; ComponentLink2Description: Handbook (7.86MB); ComponentLink2URL: http://www.altera.com/literature/hb/cyc3/cyclone3_handbook.pdf; ComponentLink3Description: Packaging Specification; ComponentLink3URL: http://www.altera.com/literature/ds/dspkg.pdf

## Sheet TSC_XPT2046.SchDoc: TFT Touchscreen Interface
size A4; Organization: Altium Limited.; Address1: Level 3, 12a Rodborough Rd; Address2: Frenchs Forest 2086; Address3: NSW; Address4: AUSTRALIA; DocumentNumber: 31; SheetNumber: 32; SheetTotal: 78
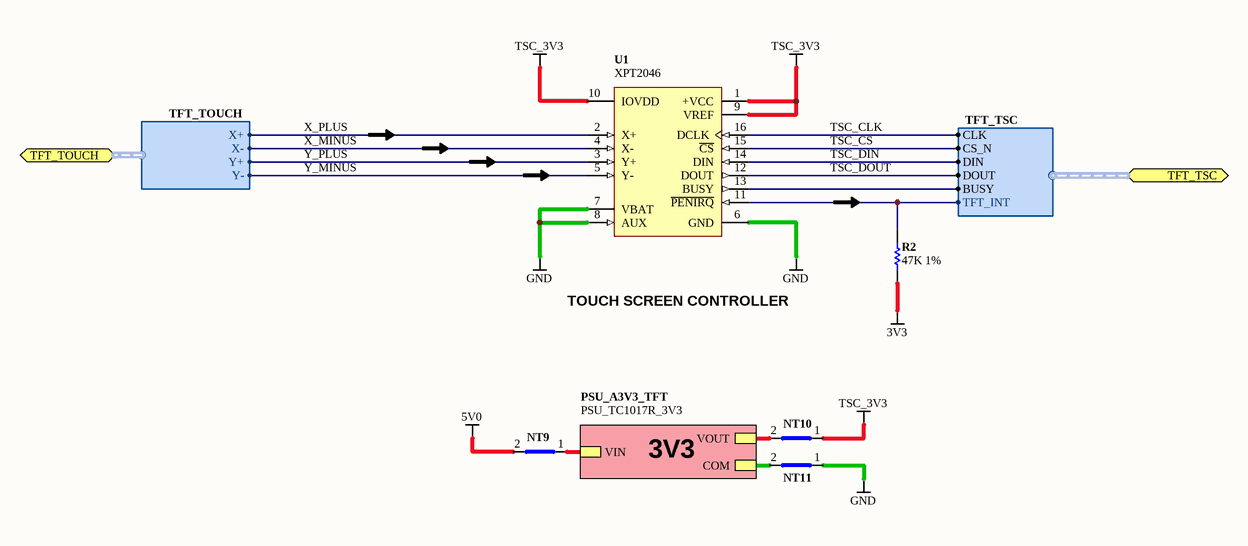
[diagram p23: TSC_XPT2046.SchDoc]

### Parts
(Parts that share a designator on the sheet are numbered #1, #2 ... from top to bottom, then left to right.)
NT9  Net Tie SMT2  [NETTIE-SMT2-31X51]  (value not drawn)  (net tie, no BOM)
NT10  Net Tie SMT2  [NETTIE-SMT2-31X51]  (value not drawn)  (net tie, no BOM)
NT11#2  Net Tie SMT2  [NETTIE-SMT2-31X51]  (value not drawn)  (net tie, no BOM)
R2#7  47K 1%  [RESC1005-STAR]
U1#5  XPT2046  [TSOP65P640-16AN]

### Sub-sheets
PSU_A3V3_TFT = PSU_TC1017R_3V3 (file not in this document): VIN, VOUT, COM

### Ports
TFT_TOUCH (harness TFT_TOUCH), TFT_TSC (harness TFT_TSC)

### Harnesses
TFT_TSC: CLK, CS_N, DIN, DOUT, BUSY, TFT_INT
TFT_TOUCH: X+, X-, Y+, Y-

### Nets
3V3: R2#7.1
5V0: NT9.2(Net2)
GND: NT11#2.1(Net1) U1#5.6(GND) U1#5.7(VBAT) U1#5.8(AUX)
TSC_3V3: NT10.1(Net1) U1#5.1(+VCC) U1#5.9(VREF) U1#5.10(IOVDD)
TSC_CLK: U1#5.16(DCLK) ; port TFT_TSC.CLK
TSC_CS: U1#5.15(~{CS}) ; port TFT_TSC.CS_N
TSC_DIN: U1#5.14(DIN) ; port TFT_TSC.DIN
TSC_DOUT: U1#5.12(DOUT) ; port TFT_TSC.DOUT
X_MINUS: U1#5.4(X-) ; port TFT_TOUCH.X-
X_PLUS: U1#5.2(X+) ; port TFT_TOUCH.X+
Y_MINUS: U1#5.5(Y-) ; port TFT_TOUCH.Y-
Y_PLUS: U1#5.3(Y+) ; port TFT_TOUCH.Y+
NetNT9_1: NT9.1(Net1) ; sheet PSU_A3V3_TFT/VIN
NetNT10_2: NT10.2(Net2) ; sheet PSU_A3V3_TFT/VOUT
NetNT11#2_2: NT11#2.2(Net2) ; sheet PSU_A3V3_TFT/COM
NetR2#7_2: R2#7.2 U1#5.11(~{PENIRQ}) ; port TFT_TSC.TFT_INT
NetU1#5_13: U1#5.13(BUSY) ; port TFT_TSC.BUSY

### Notes on the sheet
- TOUCH SCREEN CONTROLLER
- 3V3
- Sheet Title
- Project Title
- Size:
- Date:
- A4
- Assy:
- Time:
- Revision:
- Sheet
- of
- File:

### Library data of the parts
NT9 NT10 NT11#2 = D-002-0003: Net-Tie, Surface Mount, 2 x 1.6mm x 0.8mm SMT Pads - For 0.8mm Track; Category: Net-Tie; Status: Production
R2#7 = D-100-0092: Resistor, 47K 1% 0402 (1005); Power Rating: 63 mW; Category: Resistor; Mounting Technology: Surface Mount; Resistance: 47 K; Status: Production; Tolerance: 1 %
U1#5 = D-202-0006: XPT2046, Touch Screen Controller; Supply Voltage: 2.7 to 5.5 V; Mounting Technology: Surface Mount; Status: Unreleased; Temperature Range: -40 to +85 degC; Category: IC-Video

## Sheet USB_CY7C68001-56LFC.SchDoc: High-Speed USB 2.0 Controller
size A4; Organization: Altium Limited.; Address1: Level 3, 12a Rodborough Rd; Address2: Frenchs Forest 2086; Address3: NSW; Address4: AUSTRALIA; DocumentNumber: 49; SheetNumber: 50; SheetTotal: 78
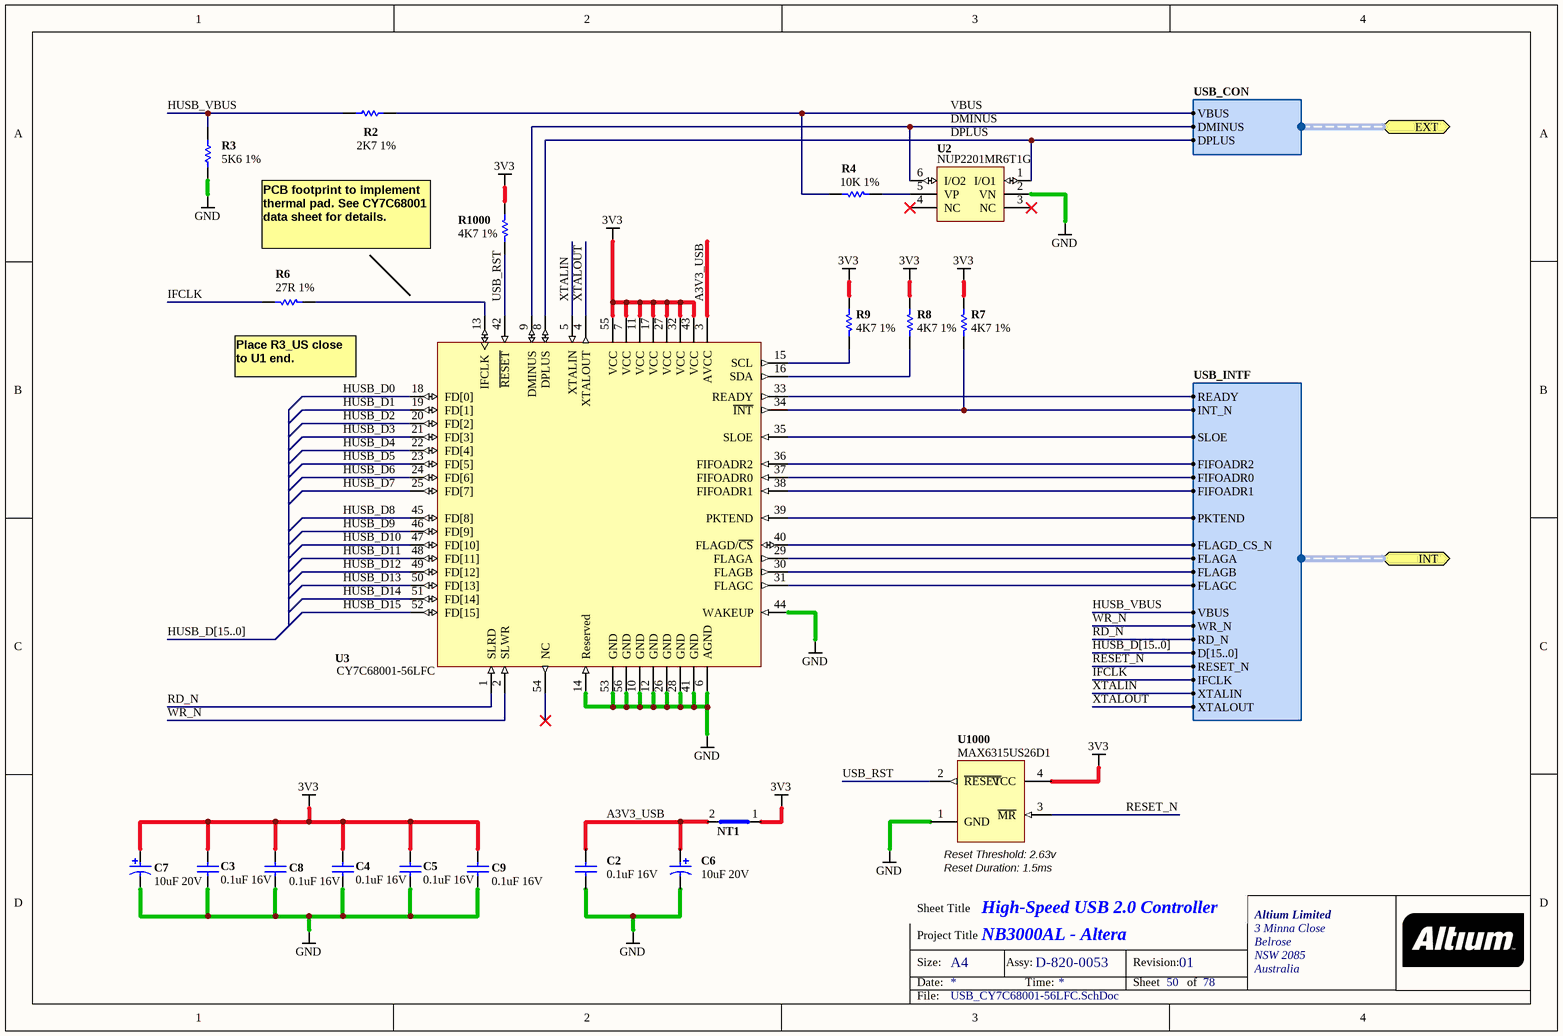
[diagram p24: USB_CY7C68001-56LFC.SchDoc]

### Parts
(Parts that share a designator on the sheet are numbered #1, #2 ... from top to bottom, then left to right.)
C2#5  0.1uF 16V  [CAPC1005-STAR]
C3#5  0.1uF 16V  [CAPC1005-STAR]
C4#5  0.1uF 16V  [CAPC1005-STAR]
C5#4  0.1uF 16V  [CAPC1005-STAR]
C6#3  10uF 20V  [CAPC3528-STAR]
C7#3  10uF 20V  [CAPC3528-STAR]
C8#3  0.1uF 16V  [CAPC1005-STAR]
C9#3  0.1uF 16V  [CAPC1005-STAR]
NT1#3  Net Tie SMT2  [NETTIE-SMT2-31X51]  (value not drawn)  (net tie, no BOM)
R2#8  2K7 1%  [RESC1005-STAR]
R3#7  5K6 1%  [RESC1005-STAR]
R4#5  10K 1%  [RESC1005-STAR]
R6#4  27R 1%  [RESC1005-STAR]
R7#4  4K7 1%  [RESC1005-STAR]
R8#4  4K7 1%  [RESC1005-STAR]
R9#4  4K7 1%  [RESC1005-STAR]
R1000  4K7 1%  [RESC1005-STAR]
U2#2  NUP2201MR6T1G  [TSOP95P275-6]
U3  CY7C68001-56LFC  [QFN50P800X800_HS-57]
U1000  MAX6315US26D1  [SOT143]

### Ports
EXT (harness USB_CON), INT (harness USB_INTF)

### Harnesses
USB_INTF: READY, INT_N, SLOE, FIFOADR2, FIFOADR0, FIFOADR1, PKTEND, FLAGD_CS_N, FLAGA, FLAGB, FLAGC, WR_N, RD_N, D[15..0], RESET_N, IFCLK, XTALIN, VBUS, XTALOUT
USB_CON: VBUS, DMINUS, DPLUS

### Nets
3V3: C3#5.2 C4#5.2 C5#4.2 C7#3.1 C8#3.1 C9#3.1 NT1#3.1(Net1) R7#4.2 R8#4.1 R9#4.1 R1000.2 U3.7(VCC) U3.11(VCC) U3.17(VCC) U3.27(VCC) U3.32(VCC) U3.43(VCC) U3.55(VCC) U1000.4(VCC)
GND: C2#5.1 C3#5.1 C4#5.1 C5#4.1 C6#3.2 C7#3.2 C8#3.2 C9#3.2 R3#7.2 U2#2.2(VN) U3.6(AGND) U3.10(GND) U3.12(GND) U3.14(Reserved) U3.26(GND) U3.28(GND) U3.41(GND) U3.44(WAKEUP) U3.53(GND) U3.56(GND) U1000.1(GND)
A3V3_USB: C2#5.2 C6#3.1 NT1#3.2(Net2) U3.3(AVCC)
DMINUS: U2#2.6(I/O2) U3.9(DMINUS) ; port EXT.DMINUS
DPLUS: U2#2.1(I/O1) U3.8(DPLUS) ; port EXT.DPLUS
HUSB_D0: U3.18(FD[0])
HUSB_D1: U3.19(FD[1])
HUSB_D2: U3.20(FD[2])
HUSB_D3: U3.21(FD[3])
HUSB_D4: U3.22(FD[4])
HUSB_D5: U3.23(FD[5])
HUSB_D6: U3.24(FD[6])
HUSB_D7: U3.25(FD[7])
HUSB_D8: U3.45(FD[8])
HUSB_D9: U3.46(FD[9])
HUSB_D10: U3.47(FD[10])
HUSB_D11: U3.48(FD[11])
HUSB_D12: U3.49(FD[12])
HUSB_D13: U3.50(FD[13])
HUSB_D14: U3.51(FD[14])
HUSB_D15: U3.52(FD[15])
HUSB_VBUS: R2#8.1 R3#7.1 ; port INT.VBUS
IFCLK: R6#4.1 ; port INT.IFCLK
RD_N: U3.1(SLRD) ; port INT.RD_N
RESET_N: U1000.3(~{MR}) ; port INT.RESET_N
USB_RST: R1000.1 U3.42(~{RESET}) U1000.2(~{RESET})
VBUS: R2#8.2 R4#5.1 ; port EXT.VBUS
WR_N: U3.2(SLWR) ; port INT.WR_N
XTALIN: U3.5(XTALIN) ; port INT.XTALIN
XTALOUT: U3.4(XTALOUT) ; port INT.XTALOUT
NetR4#5_2: R4#5.2 U2#2.5(VP)
NetR6#4_2: R6#4.2 U3.13(IFCLK)
NetR7#4_1: R7#4.1 U3.34(~{INT}) ; port INT.INT_N
NetR8#4_2: R8#4.2 U3.16(SDA)
NetR9#4_2: R9#4.2 U3.15(SCL)
NetU3_29: U3.29(FLAGA) ; port INT.FLAGA
NetU3_30: U3.30(FLAGB) ; port INT.FLAGB
NetU3_31: U3.31(FLAGC) ; port INT.FLAGC
NetU3_33: U3.33(READY) ; port INT.READY
NetU3_35: U3.35(SLOE) ; port INT.SLOE
NetU3_36: U3.36(FIFOADR2) ; port INT.FIFOADR2
NetU3_37: U3.37(FIFOADR0) ; port INT.FIFOADR0
NetU3_38: U3.38(FIFOADR1) ; port INT.FIFOADR1
NetU3_39: U3.39(PKTEND) ; port INT.PKTEND
NetU3_40: U3.40(FLAGD/~{CS}) ; port INT.FLAGD_CS_N

Not connected (* = marked no-connect by the designer): U2#2 3(NC)* 4(NC)*; U3 54(NC)*

### Buses and harness runs
bus HUSB_D[15..0]

### Notes on the sheet
- PCB footprint to implement thermal pad. See CY7C68001 data sheet for details.
- (near R6#4) Place R3_US close to U1 end.
- (near U1000) Reset Threshold: 2.63v
- (near U1000) Reset Duration: 1.5ms
- Sheet Title
- Project Title
- Size:
- Date:
- A4
- Assy:
- Time:
- Revision:
- Sheet
- of
- File:

### Library data of the parts
C2#5 C3#5 C4#5 C5#4 C8#3 C9#3 = D-101-0080: as C360 on sheet HOST_FPGA_NonIO; Category: Capacitor; Capacitance: 0.1 uF; Dielectric: X7R; Mounting Technology: Surface Mount; Rated Voltage: 16 V; Status: Production; Technology: Ceramic; Tolerance: 10 %
C6#3 C7#3 = D-101-0007: as C1#4 on sheet Ethernet_RTL8201CL; Category: Capacitor; Capacitance: 10 uF; Mounting Technology: Surface Mount; Rated Voltage: 20 V; Status: Production; Technology: Tantalum; Tolerance: 10 %
NT1#3 = D-002-0003: as NT9 on sheet TSC_XPT2046; Category: Net-Tie; Status: Production
R2#8 = D-100-0105: Resistor, 2K7 1% 0402 (1005); Power Rating: 63 mW; Resistance: 2.7 K; Category: Resistor; Mounting Technology: Surface Mount; Status: Production; Tolerance: 1 %
R3#7 = D-100-0086: Resistor, 5K6 1% 0402 (1005); Power Rating: 63 mW; Resistance: 5.6 K; Category: Resistor; Mounting Technology: Surface Mount; Status: Production; Tolerance: 1 %
R4#5 = D-100-0130: as R3#5 on sheet Host_FPGA; Category: Resistor; Mounting Technology: Surface Mount; Resistance: 10 K; Status: Production; Tolerance: 1 %
R6#4 = D-100-0108: Resistor, 27R 1% 0402 (1005); Power Rating: 63 mW; Category: Resistor; Mounting Technology: Surface Mount; Resistance: 27 R; Status: Production; Tolerance: 1 %
R7#4 R8#4 R9#4 R1000 = D-100-0088: as R1#4 on sheet Ethernet_RTL8201CL; Category: Resistor; Mounting Technology: Surface Mount; Status: Production; Tolerance: 1 %
U2#2 = D-204-0001: NUP2201MR6, Low Capacitance Diode Array, USB Protection; Max Input Voltage: mV; Max Output Current: mA; Category: IC-Power; Max Output Voltage: mV; Min Input Voltage: mV; Min Output Voltage: mV; Mounting Technology: Surface Mount; Status: Production; Supply Voltage: mV
U3 = D-221-0004: CY7C68001-56LFC, EZ-USB SX2 High-Speed USB Interface; Comm Standard: None; Category: IC-Communication; Mounting Technology: Surface Mount; Status: Production
U1000 = D-243-0000: MAX6315, Open-Drain Output SOT Reset IC, Customized Reset Thresholds, Timeout Delays; Category: IC-Other; Status: Production

## Sheet OSC_24MHZ.SchDoc: 24MHz Oscillator
size A4; Organization: Altium Limited.
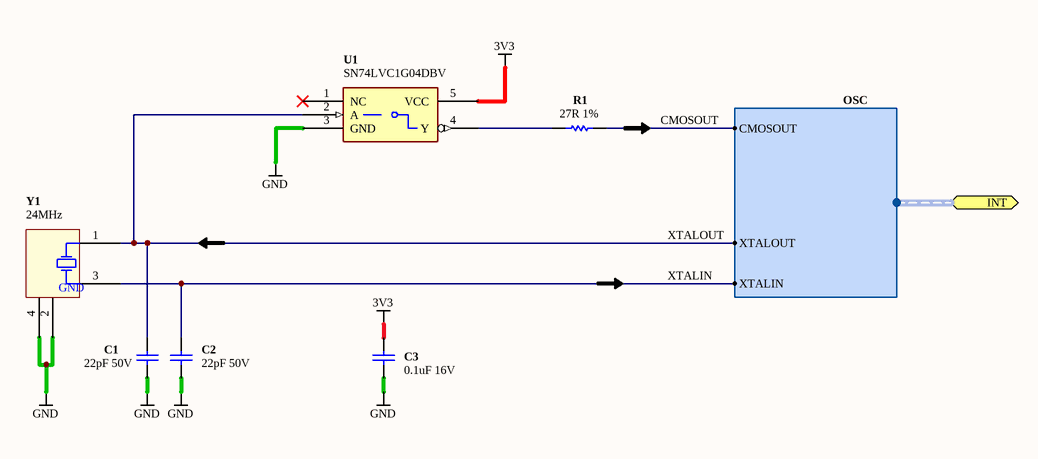
[diagram p25: OSC_24MHZ.SchDoc]

### Parts
(Parts that share a designator on the sheet are numbered #1, #2 ... from top to bottom, then left to right.)
C1#5  22pF 50V  [CAPC1005-STAR]
C2#6  22pF 50V  [CAPC1005-STAR]
C3#6  0.1uF 16V  [CAPC1005-STAR]
R1#7  27R 1%  [RESC1005-STAR]
U1#6  SN74LVC1G04DBV  [SOT95P280-5]
Y1#2  24MHz  [XTAL-200X126-4]

### Ports
INT (harness OSC)

### Harnesses
OSC: CMOSOUT, XTALIN, XTALOUT

### Nets
3V3: C3#6.1 U1#6.5(VCC)
GND: C1#5.2 C2#6.2 C3#6.2 U1#6.3(GND) Y1#2.2(GND) Y1#2.4(GND)
CMOSOUT: R1#7.1 ; port INT.CMOSOUT
XTALIN: C2#6.1 Y1#2.3(X2) ; port INT.XTALIN
XTALOUT: C1#5.1 U1#6.2(A) Y1#2.1(X1) ; port INT.XTALOUT
NetR1#7_2: R1#7.2 U1#6.4(Y)

Not connected (* = marked no-connect by the designer): U1#6 1(NC)*

### Notes on the sheet
- Sheet Title
- Project Title
- Size:
- Date:
- A4
- Assy:
- Time:
- Revision:
- Sheet
- of
- File:

### Library data of the parts
C1#5 C2#6 = D-101-0059: as C6#2 on sheet Ethernet_RTL8201CL; Category: Capacitor; Capacitance: 22 pF; Dielectric: COG; Mounting Technology: Surface Mount; Rated Voltage: 50 V; Status: Unreleased; Technology: Ceramic; Tolerance: 5 %
C3#6 = D-101-0080: as C360 on sheet HOST_FPGA_NonIO; Category: Capacitor; Capacitance: 0.1 uF; Dielectric: X7R; Mounting Technology: Surface Mount; Rated Voltage: 16 V; Status: Production; Technology: Ceramic; Tolerance: 10 %
R1#7 = D-100-0108: as R6#4 on sheet USB_CY7C68001-56LFC; Category: Resistor; Mounting Technology: Surface Mount; Resistance: 27 R; Status: Production; Tolerance: 1 %
U1#6 = D-205-0001: SN74LVC1G04DBV, Single Inverter Gate, 1.65-V to 5.5-V; Mounting Technology: Surface Mount; Status: Production; Category: IC-Logic
Y1#2 = D-103-0013: Crystal, SMD, 24.000000MHz Stab=30ppm 20.0pF; Frequency Stability: 30 ppm; Load Capacitance: 20 pF; Nominal Operational Voltage: mV; Category: Crystal; Frequency Tolerance: 30 ppm; Mounting Technology: Surface Mount; Nominal Fequency: 24 MHz; Status: Unreleased

## Sheet CON_AUDIO_AC99_NOMIC.SchDoc: AUDIO AC99 Interface
size A4; Organization: Altium Limited.; Address1: Level 3, 12a Rodborough Rd; Address2: Frenchs Forest 2086; Address3: NSW; Address4: AUSTRALIA; DocumentNumber: 59; SheetNumber: 60; SheetTotal: 78
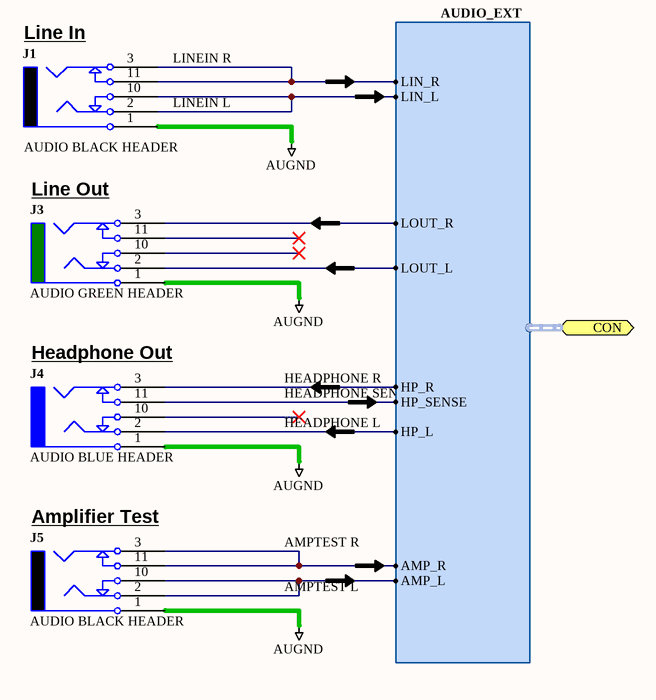
[diagram p26: CON_AUDIO_AC99_NOMIC.SchDoc]

### Parts
(Parts that share a designator on the sheet are numbered #1, #2 ... from top to bottom, then left to right.)
J1#4  AUDIO BLACK HEADER  [TSH-3675]
J3#2  AUDIO GREEN HEADER  [TSH-3675]
J4  AUDIO BLUE HEADER  [TSH-3675]
J5  AUDIO BLACK HEADER  [TSH-3675]

### Ports
CON (harness AUDIO_EXT)

### Harnesses
AUDIO_EXT: AMP_L, AMP_R, HP_L, HP_R, HP_SENSE, LIN_L, LIN_R, LOUT_L, LOUT_R

### Nets
AUGND: J1#4.1 J3#2.1 J4.1 J5.1
NetJ1#4_2: J1#4.2 J1#4.10 ; port CON.LIN_L
NetJ1#4_3: J1#4.3 J1#4.11 ; port CON.LIN_R
NetJ3#2_2: J3#2.2 ; port CON.LOUT_L
NetJ3#2_3: J3#2.3 ; port CON.LOUT_R
NetJ4_2: J4.2 ; port CON.HP_L
NetJ4_3: J4.3 ; port CON.HP_R
NetJ4_11: J4.11 ; port CON.HP_SENSE
NetJ5_2: J5.2 J5.10 ; port CON.AMP_L
NetJ5_3: J5.3 J5.11 ; port CON.AMP_R

Not connected (* = marked no-connect by the designer): J3#2 10* 11*; J4 10*

### Notes on the sheet
- (near J1#4) Line In
- LINEIN R
- LINEIN L
- (near J3#2) Line Out
- (near J4) Headphone Out
- HEADPHONE R
- HEADPHONE L
- HEADPHONE SENSE
- (near J5) Amplifier Test
- AMPTEST R
- AMPTEST L
- Sheet Title
- Project Title
- Size:
- Date:
- A4
- Assy:
- Time:
- Revision:
- Sheet
- of
- File:

### Library data of the parts
J1#4 J5 = D-300-0033: Connector, 3.5mm Stereo Audio Socket, Black, 2 break contacts (normals) and 2 auxiliary make contacts; Category: Connector; Connector type: AUDIO BLACK HEADER; Status: Production
J3#2 = D-300-0031: Connector, 3.5mm Stereo Audio Socket, Green, 2 break contacts (normals) and 2 auxiliary make contacts; Category: Connector; Connector type: AUDIO GREEN HEADER; Status: Production
J4 = D-300-0032: Connector, 3.5mm Stereo Audio Socket, Blue, 2 break contacts (normals) and 2 auxiliary make contacts; Category: Connector; Connector type: AUDIO BLUE HEADER; Status: Production